# Altium project Lattice_FPGA_development_board.PrjPcb (part 1 of 2)
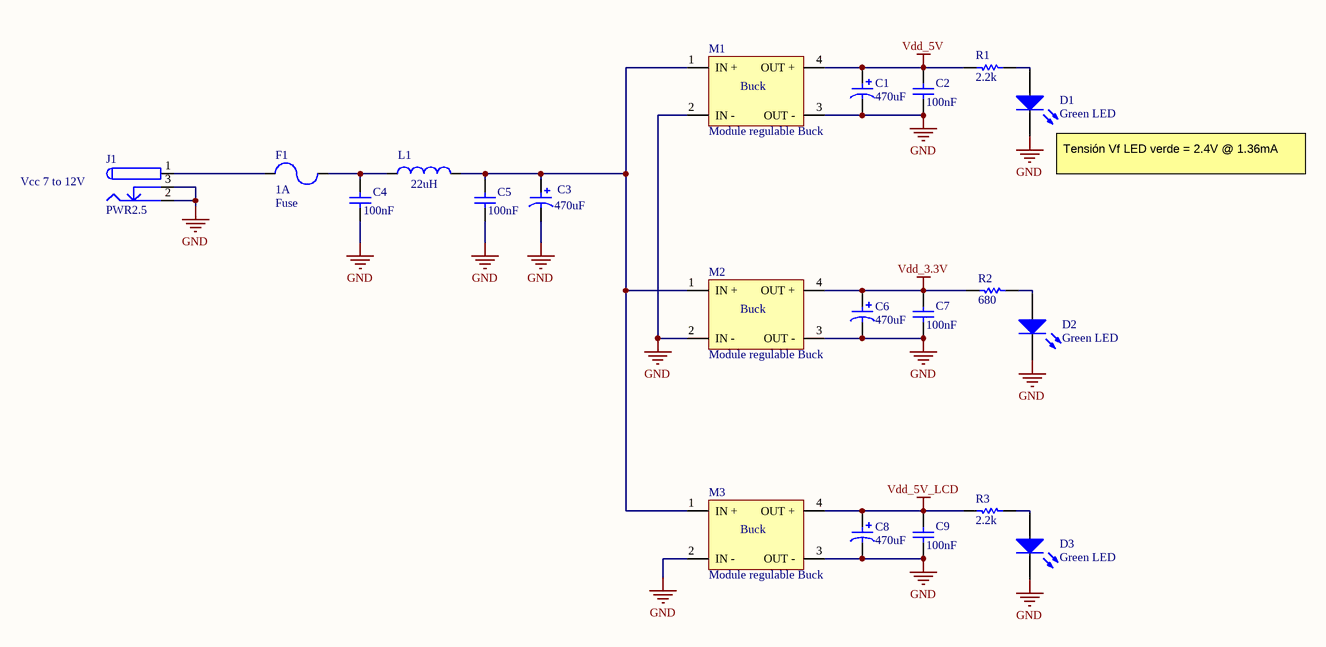
[diagram p0: power_supply.SchDoc]
18 sheets, 381 parts. Net scope: global (net labels, ports and power ports of the same name join across sheets).
Board file: PCB.PcbDoc
Sheets:
  power_supply.SchDoc
  FPGA_J3_J4.SchDoc
  FPGA_J6_J8.SchDoc
  FPGA_breadboard_connections.SchDoc
  IBM_PC_CPU.SchDoc
  IBM_PC_RAM.SchDoc
  IBM_PC_ROM_BIOS.SchDoc
  pc_data_bus_leds.SchDoc
  pc_data_bus_input_switches.SchDoc
  pc_address_bus_leds.SchDoc
  seven_segment_displays.SchDoc
  buzzer.SchDoc
  USB_TTL_converter.SchDoc
  micro_sd.SchDoc
  NOR_flash.SchDoc
  stm32h750.SchDoc
  LCD_RGB_parallel_connector.SchDoc
  stm32f411.SchDoc

## Sheet power_supply.SchDoc
size A3; SheetNumber: 1; SheetTotal: 19; SPICEModelCacheCEUNFSJS: <root> / <DocumentId>CEUNFSJS</DocumentId> / </root>

### Parts
C1  value 470uF  [electrolytic 470uF/25V]  (hidden comment: Electrolytic capacitor)
C2  value 100nF  [capacitor 0805]  (hidden comment: ceramic capacitor)
C3  value 470uF  [electrolytic 470uF/25V]  (hidden comment: Electrolytic capacitor)
C4  value 100nF  [capacitor 0805]  (hidden comment: ceramic capacitor)
C5  value 100nF  [capacitor 0805]  (hidden comment: ceramic capacitor)
C6  value 470uF  [electrolytic 470uF/25V]  (hidden comment: Electrolytic capacitor)
C7  value 100nF  [capacitor 0805]  (hidden comment: ceramic capacitor)
C8  value 470uF  [electrolytic 470uF/25V]  (hidden comment: Electrolytic capacitor)
C9  value 100nF  [capacitor 0805]  (hidden comment: ceramic capacitor)
D1  Green LED  [led 0603 clear]
D2  Green LED  [led 0603 clear]
D3  Green LED  [led 0603 clear]
F1  Fuse  value 1A  [Fuse]
J1  PWR2.5  [female connector DC-005]
L1  value 22uH  [ferrite inductor 22uH]  (hidden comment: Inductor)
M1  Module regulable Buck  [module step down MP1584]
M2  Module regulable Buck  [module step down MP1584]
M3  Module regulable Buck  [module step down MP1584]
R1  value 2.2k  [resistor 0603]  (hidden comment: resistor)
R2  value 680  [resistor 0603]  (hidden comment: resistor)
R3  value 2.2k  [resistor 0603]  (hidden comment: resistor)

### Nets
GND: C1.2 C2.2 C3.2 C4.2 C5.2 C6.2 C7.2 C8.2 C9.2 D1.2(K) D2.2(K) D3.2(K) J1.2 J1.3 M1.2(IN_-) M1.3(OUT_-) M2.2(IN_-) M2.3(OUT_-) M3.2(IN_-) M3.3(OUT_-)
Vdd_3.3V: C6.1 C7.1 M2.4(OUT_+) R2.2
Vdd_5V: C1.1 C2.1 M1.4(OUT_+) R1.2
Vdd_5V_LCD: C8.1 C9.1 M3.4(OUT_+) R3.2
NetC3_1: C3.1 C5.1 L1.2 M1.1(IN_+) M2.1(IN_+) M3.1(IN_+)
NetC4_1: C4.1 F1.2 L1.1
NetD1_1: D1.1(A) R1.1
NetD2_1: D2.1(A) R2.1
NetD3_1: D3.1(A) R3.1
NetF1_1: F1.1 J1.1

### Notes on the sheet
- Vcc 7 to 12V
- (near D1) Tensión Vf LED verde = 2.4V @ 1.36mA
- (in symbol Module regulable Step Down converter) Buck

### Library data of the parts
C2 C4 C5 C7 C9 = ceramic capacitor: Multilayer ceramic capacitor; V: 50; LCSC part: C1711; Package: 0805
D1-D3 = LED2: Green LED 0603; Package: 0603
J1 = PWR2.5: Low Voltage Power Supply Connector; Publisher: Altium Limited
M1-M3 = Module regulable Step Down converter: pin to pad: 1>2 2>1 3>4 4>3
R1-R3 = resistor: Package: 0603

## Sheet FPGA_J3_J4.SchDoc
size A3; SheetNumber: 2; SheetTotal: 18
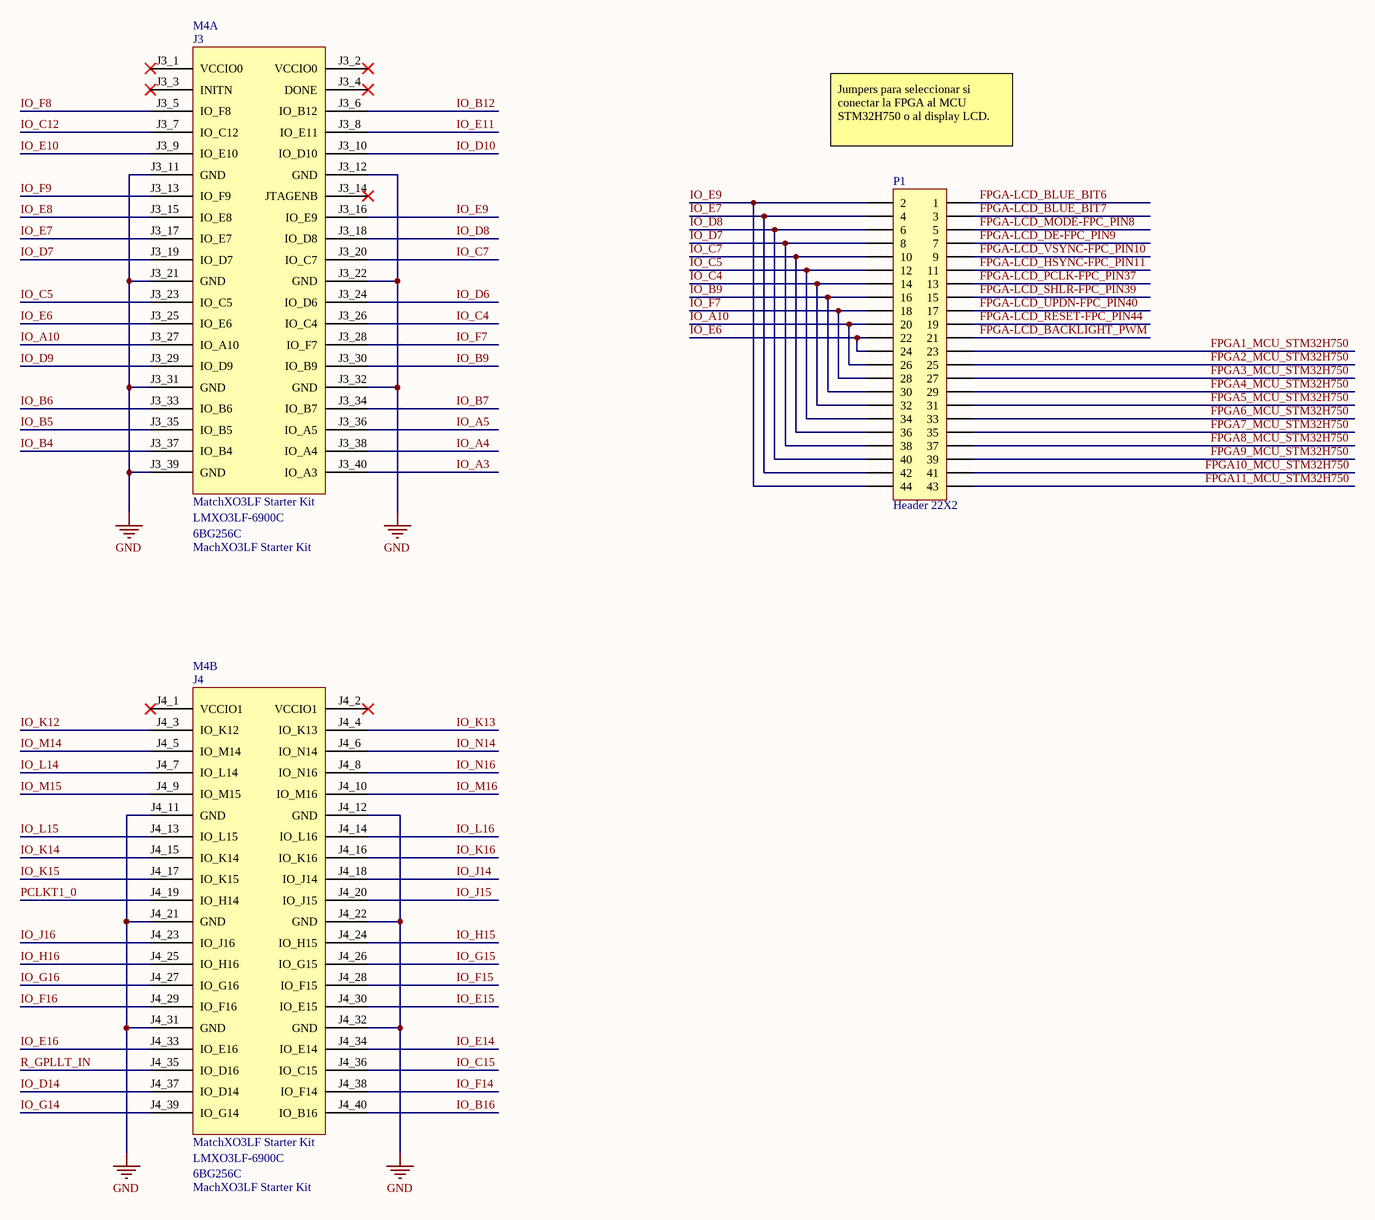
[diagram p1: FPGA_J3_J4.SchDoc]

### Parts
M4  MachXO3LF Starter Kit  [Lattice MachXO3LF starter kit]  (parts A,B of 4)
P1  Header 22X2  [HDR2X22]

### Nets
GND: M4.J3_11(GND) M4.J3_12(GND) M4.J3_21(GND) M4.J3_22(GND) M4.J3_31(GND) M4.J3_32(GND) M4.J3_39(GND) M4.J4_11(GND) M4.J4_12(GND) M4.J4_21(GND) M4.J4_22(GND) M4.J4_31(GND) M4.J4_32(GND)
FPGA1_MCU_STM32H750: P1.23
FPGA2_MCU_STM32H750: P1.25
FPGA3_MCU_STM32H750: P1.27
FPGA4_MCU_STM32H750: P1.29
FPGA5_MCU_STM32H750: P1.31
FPGA6_MCU_STM32H750: P1.33
FPGA7_MCU_STM32H750: P1.35
FPGA8_MCU_STM32H750: P1.37
FPGA9_MCU_STM32H750: P1.39
FPGA10_MCU_STM32H750: P1.41
FPGA11_MCU_STM32H750: P1.43
FPGA-LCD_BACKLIGHT_PWM: P1.21
FPGA-LCD_BLUE_BIT6: P1.1
FPGA-LCD_BLUE_BIT7: P1.3
FPGA-LCD_DE-FPC_PIN9: P1.7
FPGA-LCD_HSYNC-FPC_PIN11: P1.11
FPGA-LCD_MODE-FPC_PIN8: P1.5
FPGA-LCD_PCLK-FPC_PIN37: P1.13
FPGA-LCD_RESET-FPC_PIN44: P1.19
FPGA-LCD_SHLR-FPC_PIN39: P1.15
FPGA-LCD_UPDN-FPC_PIN40: P1.17
FPGA-LCD_VSYNC-FPC_PIN10: P1.9
IO_A3: M4.J3_40(IO_A3)
IO_A4: M4.J3_38(IO_A4)
IO_A5: M4.J3_36(IO_A5)
IO_A10: M4.J3_27(IO_A10) P1.20 P1.26
IO_B4: M4.J3_37(IO_B4)
IO_B5: M4.J3_35(IO_B5)
IO_B6: M4.J3_33(IO_B6)
IO_B7: M4.J3_34(IO_B7)
IO_B9: M4.J3_30(IO_B9) P1.16 P1.30
IO_B12: M4.J3_6(IO_B12)
IO_B16: M4.J4_40(IO_B16)
IO_C4: M4.J3_26(IO_C4) P1.14 P1.32
IO_C5: M4.J3_23(IO_C5) P1.12 P1.34
IO_C7: M4.J3_20(IO_C7) P1.10 P1.36
IO_C12: M4.J3_7(IO_C12)
IO_C15: M4.J4_36(IO_C15)
IO_D6: M4.J3_24(IO_D6)
IO_D7: M4.J3_19(IO_D7) P1.8 P1.38
IO_D8: M4.J3_18(IO_D8) P1.6 P1.40
IO_D9: M4.J3_29(IO_D9)
IO_D10: M4.J3_10(IO_D10)
IO_D14: M4.J4_37(IO_D14)
IO_E6: M4.J3_25(IO_E6) P1.22 P1.24
IO_E7: M4.J3_17(IO_E7) P1.4 P1.42
IO_E8: M4.J3_15(IO_E8)
IO_E9: M4.J3_16(IO_E9) P1.2 P1.44
IO_E10: M4.J3_9(IO_E10)
IO_E11: M4.J3_8(IO_E11)
IO_E14: M4.J4_34(IO_E14)
IO_E15: M4.J4_30(IO_E15)
IO_E16: M4.J4_33(IO_E16)
IO_F7: M4.J3_28(IO_F7) P1.18 P1.28
IO_F8: M4.J3_5(IO_F8)
IO_F9: M4.J3_13(IO_F9)
IO_F14: M4.J4_38(IO_F14)
IO_F15: M4.J4_28(IO_F15)
IO_F16: M4.J4_29(IO_F16)
IO_G14: M4.J4_39(IO_G14)
IO_G15: M4.J4_26(IO_G15)
IO_G16: M4.J4_27(IO_G16)
IO_H15: M4.J4_24(IO_H15)
IO_H16: M4.J4_25(IO_H16)
IO_J14: M4.J4_18(IO_J14)
IO_J15: M4.J4_20(IO_J15)
IO_J16: M4.J4_23(IO_J16)
IO_K12: M4.J4_3(IO_K12)
IO_K13: M4.J4_4(IO_K13)
IO_K14: M4.J4_15(IO_K14)
IO_K15: M4.J4_17(IO_K15)
IO_K16: M4.J4_16(IO_K16)
IO_L14: M4.J4_7(IO_L14)
IO_L15: M4.J4_13(IO_L15)
IO_L16: M4.J4_14(IO_L16)
IO_M14: M4.J4_5(IO_M14)
IO_M15: M4.J4_9(IO_M15)
IO_M16: M4.J4_10(IO_M16)
IO_N14: M4.J4_6(IO_N14)
IO_N16: M4.J4_8(IO_N16)
PCLKT1_0: M4.J4_19(IO_H14)
R_GPLLT_IN: M4.J4_35(IO_D16)

Not connected (* = marked no-connect by the designer): M4 J3_1(VCCIO0)* J3_2(VCCIO0)* J3_3(INITN)* J3_4(DONE)* J3_14(JTAGENB)* J4_1(VCCIO1)* J4_2(VCCIO1)*

### Notes on the sheet
- Jumpers para seleccionar si conectar la FPGA al MCU STM32H750 o al display LCD.
- (in symbol Lattice_MachXO3LF_starter_kit, part A) J3; MatchXO3LF Starter Kit; LMXO3LF-6900C; 6BG256C
- (in symbol Lattice_MachXO3LF_starter_kit, part B) J4; MatchXO3LF Starter Kit; LMXO3LF-6900C; 6BG256C

### Library data of the parts
M4 = Lattice_MachXO3LF_starter_kit: FPGA development board - MachXO3LF Starter Kit
P1 = Header 22X2: Header, 22-Pin, Dual row; LatestRevisionDate: 17-Jul-2002; LatestRevisionNote: Re-released for DXP Platform.; Publisher: Altium Limited

## Sheet FPGA_J6_J8.SchDoc
size A3; SheetNumber: 3; SheetTotal: 18
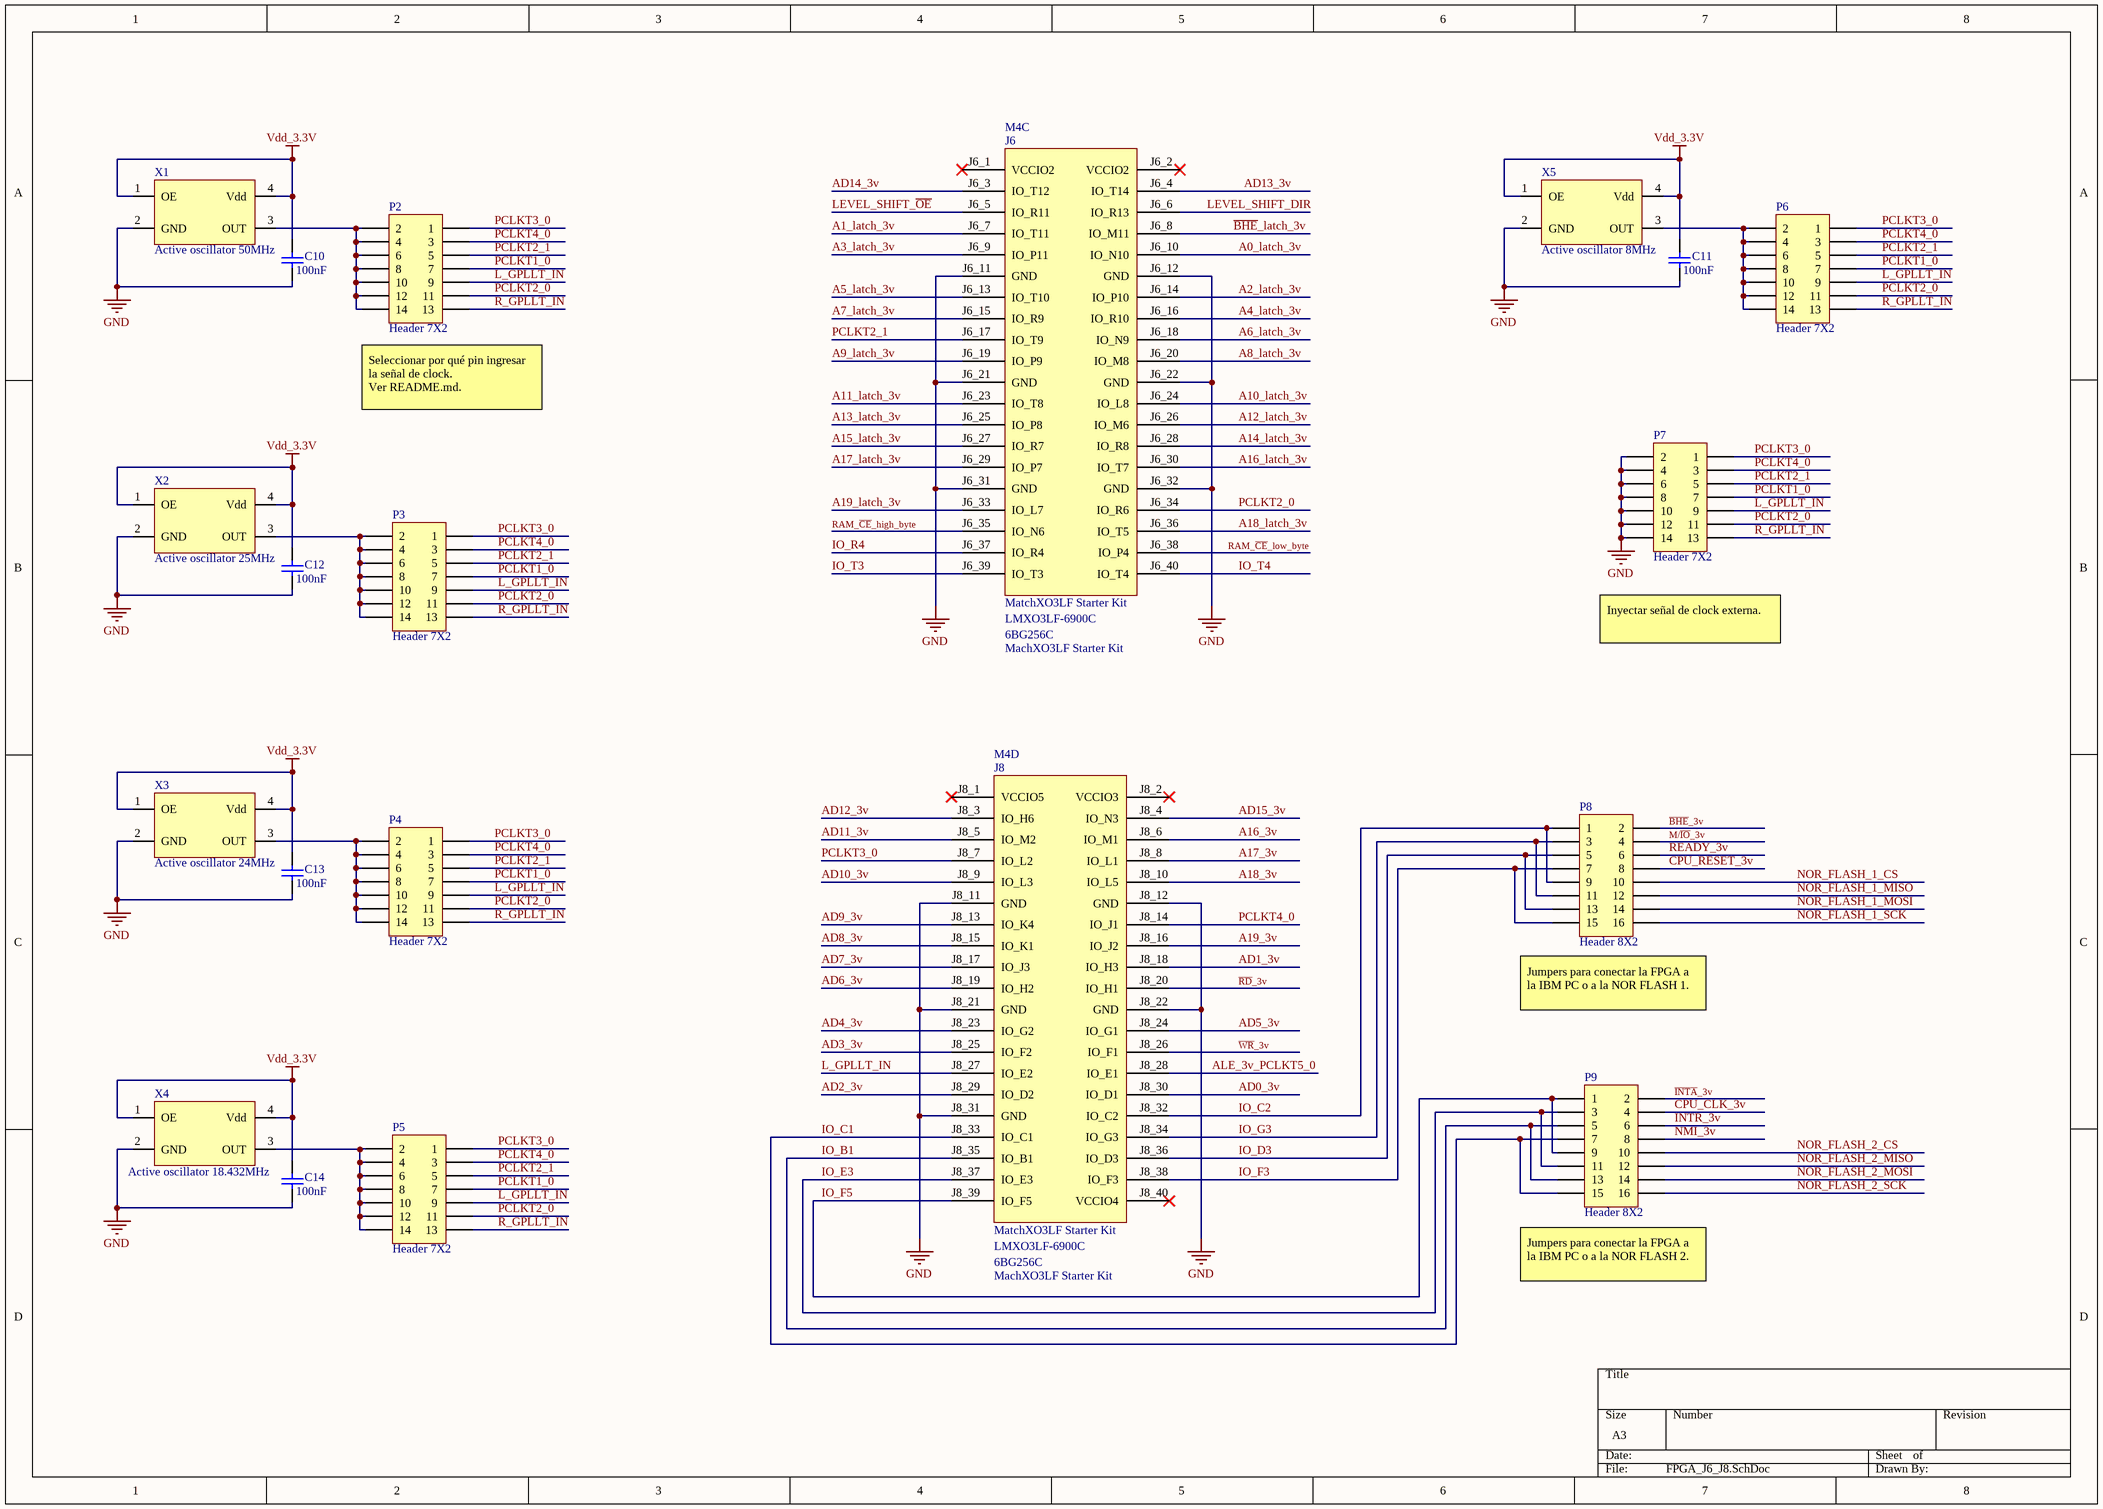
[diagram p2: FPGA_J6_J8.SchDoc]

### Parts
C10  value 100nF  [capacitor 0603]  (hidden comment: Ceramic capacitor)
C11  value 100nF  [capacitor 0603]  (hidden comment: Ceramic capacitor)
C12  value 100nF  [capacitor 0603]  (hidden comment: Ceramic capacitor)
C13  value 100nF  [capacitor 0603]  (hidden comment: Ceramic capacitor)
C14  value 100nF  [capacitor 0603]  (hidden comment: Ceramic capacitor)
M4  MachXO3LF Starter Kit  [Lattice MachXO3LF starter kit]  (parts C,D of 4)
P2  Header 7X2  [HDR2X7]
P3  Header 7X2  [HDR2X7]
P4  Header 7X2  [HDR2X7]
P5  Header 7X2  [HDR2X7]
P6  Header 7X2  [HDR2X7]
P7  Header 7X2  [HDR2X7]
P8  Header 8X2  [HDR2X8]
P9  Header 8X2  [HDR2X8]
X1  Active oscillator 50MHz  [Active oscillator 3.2mm x 2.5mm]
X2  Active oscillator 25MHz  [Active oscillator 3.2mm x 2.5mm]
X3  Active oscillator 24MHz  [Active oscillator 3.2mm x 2.5mm]
X4  Active oscillator 18.432MHz  [Active oscillator 3.2mm x 2.5mm]
X5  Active oscillator 8MHz  [Active oscillator 3.2mm x 2.5mm]

### Nets
GND: C10.1 C11.1 C12.1 C13.1 C14.1 M4.J6_11(GND) M4.J6_12(GND) M4.J6_21(GND) M4.J6_22(GND) M4.J6_31(GND) M4.J6_32(GND) M4.J8_11(GND) M4.J8_12(GND) M4.J8_21(GND) M4.J8_22(GND) M4.J8_31(GND) P7.2 P7.4 P7.6 P7.8 P7.10 P7.12 P7.14 X1.2(GND) X2.2(GND) X3.2(GND) X4.2(GND) X5.2(GND)
Vdd_3.3V: C10.2 C11.2 C12.2 C13.2 C14.2 X1.1(OE) X1.4(Vdd) X2.1(OE) X2.4(Vdd) X3.1(OE) X3.4(Vdd) X4.1(OE) X4.4(Vdd) X5.1(OE) X5.4(Vdd)
A0_latch_3v: M4.J6_10(IO_N10)
A1_latch_3v: M4.J6_7(IO_T11)
A2_latch_3v: M4.J6_14(IO_P10)
A3_latch_3v: M4.J6_9(IO_P11)
A4_latch_3v: M4.J6_16(IO_R10)
A5_latch_3v: M4.J6_13(IO_T10)
A6_latch_3v: M4.J6_18(IO_N9)
A7_latch_3v: M4.J6_15(IO_R9)
A8_latch_3v: M4.J6_20(IO_M8)
A9_latch_3v: M4.J6_19(IO_P9)
A10_latch_3v: M4.J6_24(IO_L8)
A11_latch_3v: M4.J6_23(IO_T8)
A12_latch_3v: M4.J6_26(IO_M6)
A13_latch_3v: M4.J6_25(IO_P8)
A14_latch_3v: M4.J6_28(IO_R8)
A15_latch_3v: M4.J6_27(IO_R7)
A16_3v: M4.J8_6(IO_M1)
A16_latch_3v: M4.J6_30(IO_T7)
A17_3v: M4.J8_8(IO_L1)
A17_latch_3v: M4.J6_29(IO_P7)
A18_3v: M4.J8_10(IO_L5)
A18_latch_3v: M4.J6_36(IO_T5)
A19_3v: M4.J8_16(IO_J2)
A19_latch_3v: M4.J6_33(IO_L7)
AD0_3v: M4.J8_30(IO_D1)
AD1_3v: M4.J8_18(IO_H3)
AD2_3v: M4.J8_29(IO_D2)
AD3_3v: M4.J8_25(IO_F2)
AD4_3v: M4.J8_23(IO_G2)
AD5_3v: M4.J8_24(IO_G1)
AD6_3v: M4.J8_19(IO_H2)
AD7_3v: M4.J8_17(IO_J3)
AD8_3v: M4.J8_15(IO_K1)
AD9_3v: M4.J8_13(IO_K4)
AD10_3v: M4.J8_9(IO_L3)
AD11_3v: M4.J8_5(IO_M2)
AD12_3v: M4.J8_3(IO_H6)
AD13_3v: M4.J6_4(IO_T14)
AD14_3v: M4.J6_3(IO_T12)
AD15_3v: M4.J8_4(IO_N3)
ALE_3v_PCLKT5_0: M4.J8_28(IO_E1)
~{BHE}_3v: P8.2
~{BHE}_latch_3v: M4.J6_8(IO_M11)
CPU_CLK_3v: P9.4
CPU_RESET_3v: P8.8
~{INTA}_3v: P9.2
INTR_3v: P9.6
IO_B1: M4.J8_35(IO_B1) P9.5 P9.13
IO_C1: M4.J8_33(IO_C1) P9.7 P9.15
IO_C2: M4.J8_32(IO_C2) P8.1 P8.9
IO_D3: M4.J8_36(IO_D3) P8.5 P8.13
IO_E3: M4.J8_37(IO_E3) P9.3 P9.11
IO_F3: M4.J8_38(IO_F3) P8.7 P8.15
IO_F5: M4.J8_39(IO_F5) P9.1 P9.9
IO_G3: M4.J8_34(IO_G3) P8.3 P8.11
IO_R4: M4.J6_37(IO_R4)
IO_T3: M4.J6_39(IO_T3)
IO_T4: M4.J6_40(IO_T4)
L_GPLLT_IN: M4.J8_27(IO_E2) P2.9 P3.9 P4.9 P5.9 P6.9 P7.9
LEVEL_SHIFT_DIR: M4.J6_6(IO_R13)
LEVEL_SHIFT_~{OE}: M4.J6_5(IO_R11)
M/~{IO}_3v: P8.4
NMI_3v: P9.8
NOR_FLASH_1_CS: P8.10
NOR_FLASH_1_MISO: P8.12
NOR_FLASH_1_MOSI: P8.14
NOR_FLASH_1_SCK: P8.16
NOR_FLASH_2_CS: P9.10
NOR_FLASH_2_MISO: P9.12
NOR_FLASH_2_MOSI: P9.14
NOR_FLASH_2_SCK: P9.16
PCLKT1_0: P2.7 P3.7 P4.7 P5.7 P6.7 P7.7
PCLKT2_0: M4.J6_34(IO_R6) P2.11 P3.11 P4.11 P5.11 P6.11 P7.11
PCLKT2_1: M4.J6_17(IO_T9) P2.5 P3.5 P4.5 P5.5 P6.5 P7.5
PCLKT3_0: M4.J8_7(IO_L2) P2.1 P3.1 P4.1 P5.1 P6.1 P7.1
PCLKT4_0: M4.J8_14(IO_J1) P2.3 P3.3 P4.3 P5.3 P6.3 P7.3
~{RD}_3v: M4.J8_20(IO_H1)
R_GPLLT_IN: P2.13 P3.13 P4.13 P5.13 P6.13 P7.13
RAM_~{CE}_high_byte: M4.J6_35(IO_N6)
RAM_~{CE}_low_byte: M4.J6_38(IO_P4)
READY_3v: P8.6
~{WR}_3v: M4.J8_26(IO_F1)
NetP2_2: P2.2 P2.4 P2.6 P2.8 P2.10 P2.12 P2.14 X1.3(OUT)
NetP3_2: P3.2 P3.4 P3.6 P3.8 P3.10 P3.12 P3.14 X2.3(OUT)
NetP4_2: P4.2 P4.4 P4.6 P4.8 P4.10 P4.12 P4.14 X3.3(OUT)
NetP5_2: P5.2 P5.4 P5.6 P5.8 P5.10 P5.12 P5.14 X4.3(OUT)
NetP6_2: P6.2 P6.4 P6.6 P6.8 P6.10 P6.12 P6.14 X5.3(OUT)

Not connected (* = marked no-connect by the designer): M4 J6_1(VCCIO2)* J6_2(VCCIO2)* J8_1(VCCIO5)* J8_2(VCCIO3)* J8_40(VCCIO4)*

### Notes on the sheet
- (near P2) Seleccionar por qué pin ingresar la señal de clock.
  Ver README.md.
- Inyectar señal de clock externa.
- (near P8) Jumpers para conectar la FPGA a la IBM PC o a la NOR FLASH 1.
- (near P9) Jumpers para conectar la FPGA a la IBM PC o a la NOR FLASH 2.
- (in symbol Lattice_MachXO3LF_starter_kit, part C) J6; MatchXO3LF Starter Kit; LMXO3LF-6900C; 6BG256C
- (in symbol Lattice_MachXO3LF_starter_kit, part D) J8; MatchXO3LF Starter Kit; LMXO3LF-6900C; 6BG256C

### Library data of the parts
C10-C14 = Ceramic capacitor: Multilayer ceramic capacitor; V: 50; LCSC part: C14663; Package: 0603
M4 = Lattice_MachXO3LF_starter_kit: as M4 on sheet FPGA_J3_J4
P2-P7 = Header 7X2: Header, 7-Pin, Dual row; LatestRevisionDate: 17-Jul-2002; LatestRevisionNote: Re-released for DXP Platform.; Publisher: Altium Limited
P8 P9 = Header 8X2: Header, 8-Pin, Dual row; LatestRevisionDate: 17-Jul-2002; LatestRevisionNote: Re-released for DXP Platform.; Publisher: Altium Limited
X1-X5 = Active oscillator

## Sheet FPGA_breadboard_connections.SchDoc
size A3; SheetNumber: 4; SheetTotal: 18
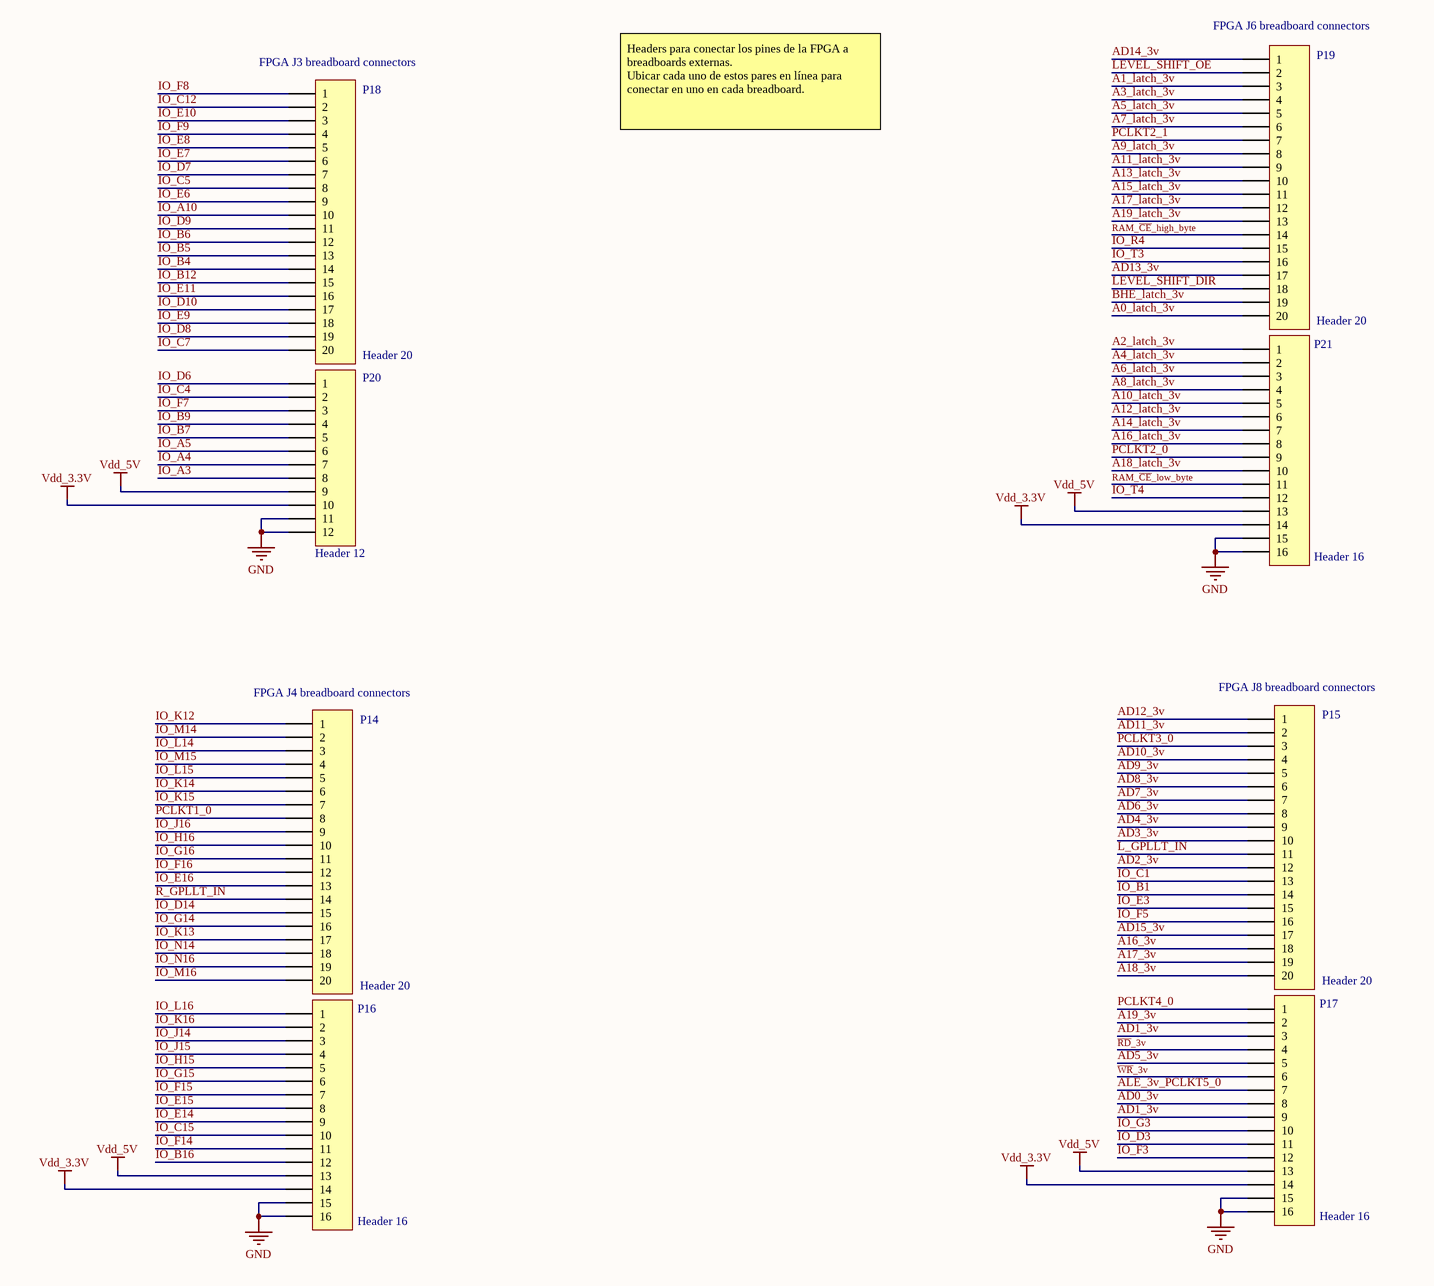
[diagram p3: FPGA_breadboard_connections.SchDoc]

### Parts
P14  Header 20  [HDR1X20]
P15  Header 20  [HDR1X20]
P16  Header 16  [HDR1X16]
P17  Header 16  [HDR1X16]
P18  Header 20  [HDR1X20]
P19  Header 20  [HDR1X20]
P20  Header 12  [HDR1X12]
P21  Header 16  [HDR1X16]

### Nets
GND: P16.15 P16.16 P17.15 P17.16 P20.11 P20.12 P21.15 P21.16
Vdd_3.3V: P16.14 P17.14 P20.10 P21.14
Vdd_5V: P16.13 P17.13 P20.9 P21.13
A0_latch_3v: P19.20
A1_latch_3v: P19.3
A2_latch_3v: P21.1
A3_latch_3v: P19.4
A4_latch_3v: P21.2
A5_latch_3v: P19.5
A6_latch_3v: P21.3
A7_latch_3v: P19.6
A8_latch_3v: P21.4
A9_latch_3v: P19.8
A10_latch_3v: P21.5
A11_latch_3v: P19.9
A12_latch_3v: P21.6
A13_latch_3v: P19.10
A14_latch_3v: P21.7
A15_latch_3v: P19.11
A16_3v: P15.18
A16_latch_3v: P21.8
A17_3v: P15.19
A17_latch_3v: P19.12
A18_3v: P15.20
A18_latch_3v: P21.10
A19_3v: P17.2
A19_latch_3v: P19.13
AD0_3v: P17.8
AD1_3v: P17.3 P17.9
AD2_3v: P15.12
AD3_3v: P15.10
AD4_3v: P15.9
AD5_3v: P17.5
AD6_3v: P15.8
AD7_3v: P15.7
AD8_3v: P15.6
AD9_3v: P15.5
AD10_3v: P15.4
AD11_3v: P15.2
AD12_3v: P15.1
AD13_3v: P19.17
AD14_3v: P19.1
AD15_3v: P15.17
ALE_3v_PCLKT5_0: P17.7
~{BHE}_latch_3v: P19.19
IO_A3: P20.8
IO_A4: P20.7
IO_A5: P20.6
IO_A10: P18.10
IO_B1: P15.14
IO_B4: P18.14
IO_B5: P18.13
IO_B6: P18.12
IO_B7: P20.5
IO_B9: P20.4
IO_B12: P18.15
IO_B16: P16.12
IO_C1: P15.13
IO_C4: P20.2
IO_C5: P18.8
IO_C7: P18.20
IO_C12: P18.2
IO_C15: P16.10
IO_D3: P17.11
IO_D6: P20.1
IO_D7: P18.7
IO_D8: P18.19
IO_D9: P18.11
IO_D10: P18.17
IO_D14: P14.15
IO_E3: P15.15
IO_E6: P18.9
IO_E7: P18.6
IO_E8: P18.5
IO_E9: P18.18
IO_E10: P18.3
IO_E11: P18.16
IO_E14: P16.9
IO_E15: P16.8
IO_E16: P14.13
IO_F3: P17.12
IO_F5: P15.16
IO_F7: P20.3
IO_F8: P18.1
IO_F9: P18.4
IO_F14: P16.11
IO_F15: P16.7
IO_F16: P14.12
IO_G3: P17.10
IO_G14: P14.16
IO_G15: P16.6
IO_G16: P14.11
IO_H15: P16.5
IO_H16: P14.10
IO_J14: P16.3
IO_J15: P16.4
IO_J16: P14.9
IO_K12: P14.1
IO_K13: P14.17
IO_K14: P14.6
IO_K15: P14.7
IO_K16: P16.2
IO_L14: P14.3
IO_L15: P14.5
IO_L16: P16.1
IO_M14: P14.2
IO_M15: P14.4
IO_M16: P14.20
IO_N14: P14.18
IO_N16: P14.19
IO_R4: P19.15
IO_T3: P19.16
IO_T4: P21.12
L_GPLLT_IN: P15.11
LEVEL_SHIFT_DIR: P19.18
LEVEL_SHIFT_~{OE}: P19.2
PCLKT1_0: P14.8
PCLKT2_0: P21.9
PCLKT2_1: P19.7
PCLKT3_0: P15.3
PCLKT4_0: P17.1
~{RD}_3v: P17.4
R_GPLLT_IN: P14.14
RAM_~{CE}_high_byte: P19.14
RAM_~{CE}_low_byte: P21.11
~{WR}_3v: P17.6

### Notes on the sheet
- (near P19) FPGA J6 breadboard connectors
- (near P18) FPGA J3 breadboard connectors
- Headers para conectar los pines de la FPGA a breadboards externas.
  Ubicar cada uno de estos pares en línea para conectar en uno en cada breadboard.
- (near P14) FPGA J4 breadboard connectors
- (near P15) FPGA J8 breadboard connectors

### Library data of the parts
P14 P15 P18 P19 = Header 20: Header, 20-Pin; LatestRevisionDate: 17-Jul-2002; LatestRevisionNote: Re-released for DXP Platform.; Publisher: Altium Limited
P16 P17 P21 = Header 16: Header, 16-Pin; LatestRevisionDate: 17-Jul-2002; LatestRevisionNote: Re-released for DXP Platform.; Publisher: Altium Limited
P20 = Header 12: Header, 12-Pin; LatestRevisionDate: 17-Jul-2002; LatestRevisionNote: Re-released for DXP Platform.; Publisher: Altium Limited

## Sheet IBM_PC_CPU.SchDoc
size A3; SheetNumber: 6; SheetTotal: 18
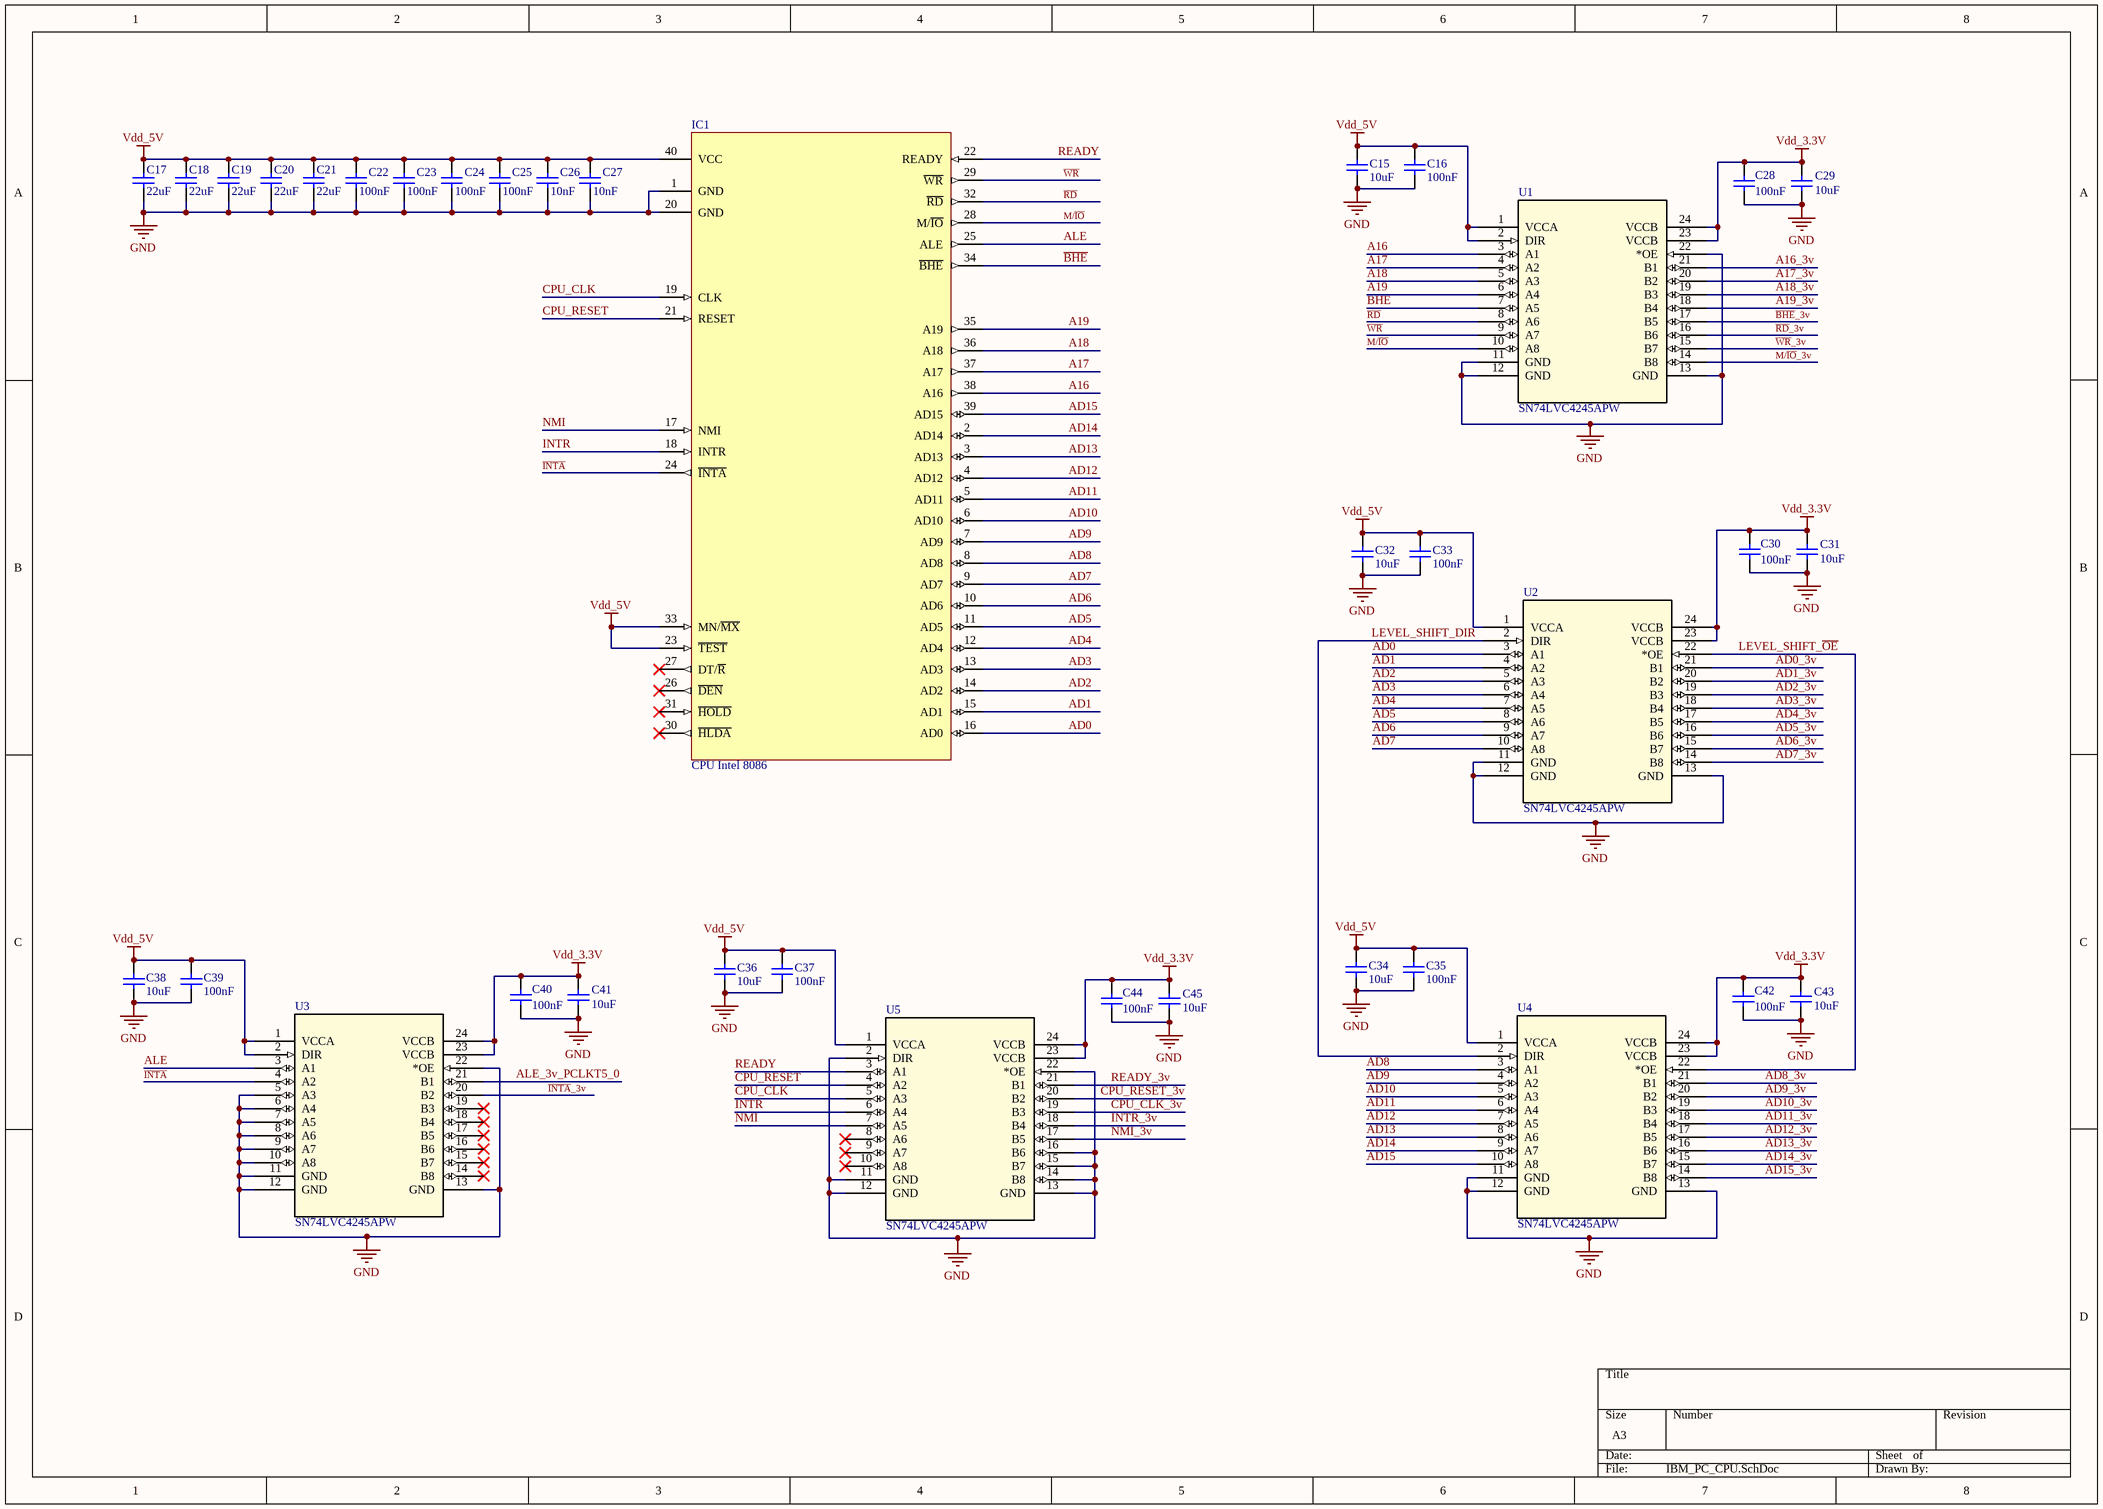
[diagram p4: IBM_PC_CPU.SchDoc]

### Parts
C15  value 10uF  [capacitor 0603]  (hidden comment: ceramic capacitor)
C16  value 100nF  [capacitor 0603]  (hidden comment: Ceramic capacitor)
C17  value 22uF  [capacitor 0805]  (hidden comment: ceramic capacitor)
C18  value 22uF  [capacitor 0805]  (hidden comment: ceramic capacitor)
C19  value 22uF  [capacitor 0805]  (hidden comment: ceramic capacitor)
C20  value 22uF  [capacitor 0805]  (hidden comment: ceramic capacitor)
C21  value 22uF  [capacitor 0805]  (hidden comment: ceramic capacitor)
C22  value 100nF  [capacitor 0805]  (hidden comment: ceramic capacitor)
C23  value 100nF  [capacitor 0805]  (hidden comment: ceramic capacitor)
C24  value 100nF  [capacitor 0805]  (hidden comment: ceramic capacitor)
C25  value 100nF  [capacitor 0805]  (hidden comment: ceramic capacitor)
C26  value 10nF  [capacitor 0805]  (hidden comment: ceramic capacitor)
C27  value 10nF  [capacitor 0805]  (hidden comment: ceramic capacitor)
C28  value 100nF  [capacitor 0603]  (hidden comment: Ceramic capacitor)
C29  value 10uF  [capacitor 0603]  (hidden comment: ceramic capacitor)
C30  value 100nF  [capacitor 0603]  (hidden comment: Ceramic capacitor)
C31  value 10uF  [capacitor 0603]  (hidden comment: ceramic capacitor)
C32  value 10uF  [capacitor 0603]  (hidden comment: ceramic capacitor)
C33  value 100nF  [capacitor 0603]  (hidden comment: Ceramic capacitor)
C34  value 10uF  [capacitor 0603]  (hidden comment: ceramic capacitor)
C35  value 100nF  [capacitor 0603]  (hidden comment: Ceramic capacitor)
C36  value 10uF  [capacitor 0603]  (hidden comment: ceramic capacitor)
C37  value 100nF  [capacitor 0603]  (hidden comment: Ceramic capacitor)
C38  value 10uF  [capacitor 0603]  (hidden comment: ceramic capacitor)
C39  value 100nF  [capacitor 0603]  (hidden comment: Ceramic capacitor)
C40  value 100nF  [capacitor 0603]  (hidden comment: Ceramic capacitor)
C41  value 10uF  [capacitor 0603]  (hidden comment: ceramic capacitor)
C42  value 100nF  [capacitor 0603]  (hidden comment: Ceramic capacitor)
C43  value 10uF  [capacitor 0603]  (hidden comment: ceramic capacitor)
C44  value 100nF  [capacitor 0603]  (hidden comment: Ceramic capacitor)
C45  value 10uF  [capacitor 0603]  (hidden comment: ceramic capacitor)
IC1  CPU Intel 8086  [PDIP-40PIN]
U1  SN74LVC4245APW  [PW24]
U2  SN74LVC4245APW  [PW24]
U3  SN74LVC4245APW  [PW24]
U4  SN74LVC4245APW  [PW24]
U5  SN74LVC4245APW  [PW24]

### Nets
GND: C15.1 C16.1 C17.1 C18.1 C19.1 C20.1 C21.1 C22.2 C23.2 C24.2 C25.2 C26.2 C27.2 C28.1 C29.1 C30.1 C31.1 C32.1 C33.1 C34.1 C35.1 C36.1 C37.1 C38.1 C39.1 C40.1 C41.1 C42.1 C43.1 C44.1 C45.1 IC1.1(GND) IC1.20(GND) U1.11(GND) U1.12(GND) U1.13(GND) U1.22(*OE) U2.11(GND) U2.12(GND) U2.13(GND) U3.5(A3) U3.6(A4) U3.7(A5) U3.8(A6) U3.9(A7) U3.10(A8) U3.11(GND) U3.12(GND) U3.13(GND) U3.22(*OE) U4.11(GND) U4.12(GND) U4.13(GND) U5.2(DIR) U5.11(GND) U5.12(GND) U5.13(GND) U5.14(B8) U5.15(B7) U5.16(B6) U5.22(*OE)
Vdd_3.3V: C28.2 C29.2 C30.2 C31.2 C40.2 C41.2 C42.2 C43.2 C44.2 C45.2 U1.23(VCCB) U1.24(VCCB) U2.23(VCCB) U2.24(VCCB) U3.23(VCCB) U3.24(VCCB) U4.23(VCCB) U4.24(VCCB) U5.23(VCCB) U5.24(VCCB)
Vdd_5V: C15.2 C16.2 C17.2 C18.2 C19.2 C20.2 C21.2 C22.1 C23.1 C24.1 C25.1 C26.1 C27.1 C32.2 C33.2 C34.2 C35.2 C36.2 C37.2 C38.2 C39.2 IC1.23(~{TEST}) IC1.33(MN/~{MX}) IC1.40(VCC) U1.1(VCCA) U1.2(DIR) U2.1(VCCA) U3.1(VCCA) U3.2(DIR) U4.1(VCCA) U5.1(VCCA)
A16: IC1.38(A16) U1.3(A1)
A16_3v: U1.21(B1)
A17: IC1.37(A17) U1.4(A2)
A17_3v: U1.20(B2)
A18: IC1.36(A18) U1.5(A3)
A18_3v: U1.19(B3)
A19: IC1.35(A19) U1.6(A4)
A19_3v: U1.18(B4)
AD0: IC1.16(AD0) U2.3(A1)
AD0_3v: U2.21(B1)
AD1: IC1.15(AD1) U2.4(A2)
AD1_3v: U2.20(B2)
AD2: IC1.14(AD2) U2.5(A3)
AD2_3v: U2.19(B3)
AD3: IC1.13(AD3) U2.6(A4)
AD3_3v: U2.18(B4)
AD4: IC1.12(AD4) U2.7(A5)
AD4_3v: U2.17(B5)
AD5: IC1.11(AD5) U2.8(A6)
AD5_3v: U2.16(B6)
AD6: IC1.10(AD6) U2.9(A7)
AD6_3v: U2.15(B7)
AD7: IC1.9(AD7) U2.10(A8)
AD7_3v: U2.14(B8)
AD8: IC1.8(AD8) U4.3(A1)
AD8_3v: U4.21(B1)
AD9: IC1.7(AD9) U4.4(A2)
AD9_3v: U4.20(B2)
AD10: IC1.6(AD10) U4.5(A3)
AD10_3v: U4.19(B3)
AD11: IC1.5(AD11) U4.6(A4)
AD11_3v: U4.18(B4)
AD12: IC1.4(AD12) U4.7(A5)
AD12_3v: U4.17(B5)
AD13: IC1.3(AD13) U4.8(A6)
AD13_3v: U4.16(B6)
AD14: IC1.2(AD14) U4.9(A7)
AD14_3v: U4.15(B7)
AD15: IC1.39(AD15) U4.10(A8)
AD15_3v: U4.14(B8)
ALE: IC1.25(ALE) U3.3(A1)
ALE_3v_PCLKT5_0: U3.21(B1)
~{BHE}: IC1.34(~{BHE}) U1.7(A5)
~{BHE}_3v: U1.17(B5)
CPU_CLK: IC1.19(CLK) U5.5(A3)
CPU_CLK_3v: U5.19(B3)
CPU_RESET: IC1.21(RESET) U5.4(A2)
CPU_RESET_3v: U5.20(B2)
~{INTA}: IC1.24(~{INTA}) U3.4(A2)
~{INTA}_3v: U3.20(B2)
INTR: IC1.18(INTR) U5.6(A4)
INTR_3v: U5.18(B4)
LEVEL_SHIFT_DIR: U2.2(DIR) U4.2(DIR)
LEVEL_SHIFT_~{OE}: U2.22(*OE) U4.22(*OE)
M/~{IO}: IC1.28(M/~{IO}) U1.10(A8)
M/~{IO}_3v: U1.14(B8)
NMI: IC1.17(NMI) U5.7(A5)
NMI_3v: U5.17(B5)
~{RD}: IC1.32(~{RD}) U1.8(A6)
~{RD}_3v: U1.16(B6)
READY: IC1.22(READY) U5.3(A1)
READY_3v: U5.21(B1)
~{WR}: IC1.29(~{WR}) U1.9(A7)
~{WR}_3v: U1.15(B7)

Not connected (* = marked no-connect by the designer): IC1 26(~{DEN})* 27(DT/~{R})* 30(~{HLDA})* 31(~{HOLD})*; U3 14(B8)* 15(B7)* 16(B6)* 17(B5)* 18(B4)* 19(B3)*; U5 8(A6)* 9(A7)* 10(A8)*

### Library data of the parts
C15 C29 C31 C32 C34 C36 C38 C41 C43 C45 = ceramic capacitor: Multilayer ceramic capacitor; V: 6.3; LCSC part: C1691; Package: 0603
C16 C28 C30 C33 C35 C37 C39 C40 C42 C44 = Ceramic capacitor: Multilayer ceramic capacitor; V: 50; LCSC part: C14663; Package: 0603
C17-C21 = ceramic capacitor: Multilayer ceramic capacitor; V: 25; LCSC part: C45783; Package: 0805
C22-C27 = ceramic capacitor: Multilayer ceramic capacitor; V: 50; Package: 0805
  C22-C25: LCSC part: C1711
  C26 C27: LCSC part: C1710
U1-U5 = SN74LVC4245APW: Octal Bus Transceiver And 3.3-V To 5-V Shifter With 3-State Outputs 24-TSSOP -40 to 85; Manufacturer_Name: Texas Instruments; Copyright: Copyright (C) 2025 Ultra Librarian. All rights reserved.; Manufacturer_Part_Number: SN74LVC4245APW; RefDes: RefDes; Type: Type

## Sheet IBM_PC_RAM.SchDoc
size A3; SheetNumber: 7; SheetTotal: 18
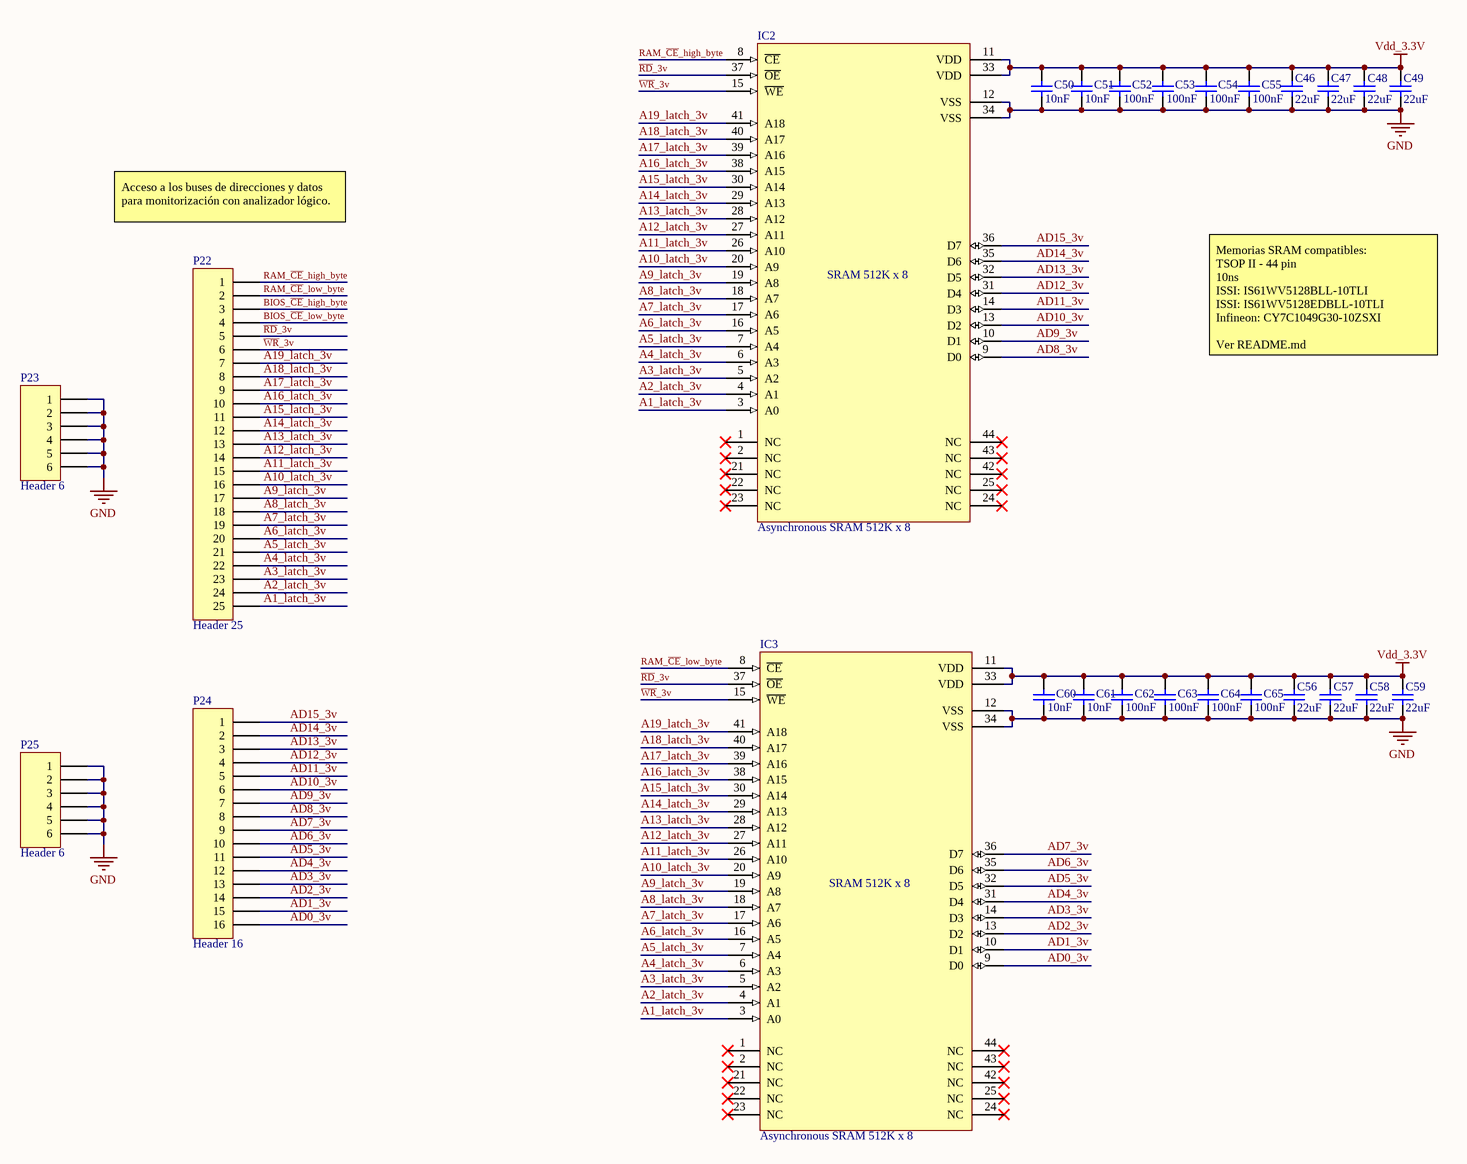
[diagram p5: IBM_PC_RAM.SchDoc]

### Parts
C46  value 22uF  [capacitor 0603]  (hidden comment: ceramic capacitor)
C47  value 22uF  [capacitor 0603]  (hidden comment: ceramic capacitor)
C48  value 22uF  [capacitor 0603]  (hidden comment: ceramic capacitor)
C49  value 22uF  [capacitor 0603]  (hidden comment: ceramic capacitor)
C50  value 10nF  [capacitor 0603]  (hidden comment: Ceramic capacitor)
C51  value 10nF  [capacitor 0603]  (hidden comment: Ceramic capacitor)
C52  value 100nF  [capacitor 0603]  (hidden comment: Ceramic capacitor)
C53  value 100nF  [capacitor 0603]  (hidden comment: Ceramic capacitor)
C54  value 100nF  [capacitor 0603]  (hidden comment: Ceramic capacitor)
C55  value 100nF  [capacitor 0603]  (hidden comment: Ceramic capacitor)
C56  value 22uF  [capacitor 0603]  (hidden comment: ceramic capacitor)
C57  value 22uF  [capacitor 0603]  (hidden comment: ceramic capacitor)
C58  value 22uF  [capacitor 0603]  (hidden comment: ceramic capacitor)
C59  value 22uF  [capacitor 0603]  (hidden comment: ceramic capacitor)
C60  value 10nF  [capacitor 0603]  (hidden comment: Ceramic capacitor)
C61  value 10nF  [capacitor 0603]  (hidden comment: Ceramic capacitor)
C62  value 100nF  [capacitor 0603]  (hidden comment: Ceramic capacitor)
C63  value 100nF  [capacitor 0603]  (hidden comment: Ceramic capacitor)
C64  value 100nF  [capacitor 0603]  (hidden comment: Ceramic capacitor)
C65  value 100nF  [capacitor 0603]  (hidden comment: Ceramic capacitor)
IC2  Asynchronous SRAM 512K x 8  [TSOP II - 44pin]
IC3  Asynchronous SRAM 512K x 8  [TSOP II - 44pin]
P22  Header 25  [HDR1X25]
P23  Header 6  [HDR1X6]
P24  Header 16  [HDR1X16]
P25  Header 6  [HDR1X6]

### Nets
GND: C46.1 C47.1 C48.1 C49.1 C50.1 C51.1 C52.1 C53.1 C54.1 C55.1 C56.1 C57.1 C58.1 C59.1 C60.1 C61.1 C62.1 C63.1 C64.1 C65.1 IC2.12(VSS) IC2.34(VSS) IC3.12(VSS) IC3.34(VSS) P23.1 P23.2 P23.3 P23.4 P23.5 P23.6 P25.1 P25.2 P25.3 P25.4 P25.5 P25.6
Vdd_3.3V: C46.2 C47.2 C48.2 C49.2 C50.2 C51.2 C52.2 C53.2 C54.2 C55.2 C56.2 C57.2 C58.2 C59.2 C60.2 C61.2 C62.2 C63.2 C64.2 C65.2 IC2.11(VDD) IC2.33(VDD) IC3.11(VDD) IC3.33(VDD)
A1_latch_3v: IC2.3(A0) IC3.3(A0) P22.25
A2_latch_3v: IC2.4(A1) IC3.4(A1) P22.24
A3_latch_3v: IC2.5(A2) IC3.5(A2) P22.23
A4_latch_3v: IC2.6(A3) IC3.6(A3) P22.22
A5_latch_3v: IC2.7(A4) IC3.7(A4) P22.21
A6_latch_3v: IC2.16(A5) IC3.16(A5) P22.20
A7_latch_3v: IC2.17(A6) IC3.17(A6) P22.19
A8_latch_3v: IC2.18(A7) IC3.18(A7) P22.18
A9_latch_3v: IC2.19(A8) IC3.19(A8) P22.17
A10_latch_3v: IC2.20(A9) IC3.20(A9) P22.16
A11_latch_3v: IC2.26(A10) IC3.26(A10) P22.15
A12_latch_3v: IC2.27(A11) IC3.27(A11) P22.14
A13_latch_3v: IC2.28(A12) IC3.28(A12) P22.13
A14_latch_3v: IC2.29(A13) IC3.29(A13) P22.12
A15_latch_3v: IC2.30(A14) IC3.30(A14) P22.11
A16_latch_3v: IC2.38(A15) IC3.38(A15) P22.10
A17_latch_3v: IC2.39(A16) IC3.39(A16) P22.9
A18_latch_3v: IC2.40(A17) IC3.40(A17) P22.8
A19_latch_3v: IC2.41(A18) IC3.41(A18) P22.7
AD0_3v: IC3.9(D0) P24.16
AD1_3v: IC3.10(D1) P24.15
AD2_3v: IC3.13(D2) P24.14
AD3_3v: IC3.14(D3) P24.13
AD4_3v: IC3.31(D4) P24.12
AD5_3v: IC3.32(D5) P24.11
AD6_3v: IC3.35(D6) P24.10
AD7_3v: IC3.36(D7) P24.9
AD8_3v: IC2.9(D0) P24.8
AD9_3v: IC2.10(D1) P24.7
AD10_3v: IC2.13(D2) P24.6
AD11_3v: IC2.14(D3) P24.5
AD12_3v: IC2.31(D4) P24.4
AD13_3v: IC2.32(D5) P24.3
AD14_3v: IC2.35(D6) P24.2
AD15_3v: IC2.36(D7) P24.1
BIOS_~{CE}_high_byte: P22.3
BIOS_~{CE}_low_byte: P22.4
~{RD}_3v: IC2.37(~{OE}) IC3.37(~{OE}) P22.5
RAM_~{CE}_high_byte: IC2.8(~{CE}) P22.1
RAM_~{CE}_low_byte: IC3.8(~{CE}) P22.2
~{WR}_3v: IC2.15(~{WE}) IC3.15(~{WE}) P22.6

Not connected (* = marked no-connect by the designer): IC2 1(NC)* 2(NC)* 21(NC)* 22(NC)* 23(NC)* 24(NC)* 25(NC)* 42(NC)* 43(NC)* 44(NC)*; IC3 1(NC)* 2(NC)* 21(NC)* 22(NC)* 23(NC)* 24(NC)* 25(NC)* 42(NC)* 43(NC)* 44(NC)*

### Notes on the sheet
- Acceso a los buses de direcciones y datos para monitorización con analizador lógico.
- Memorias SRAM compatibles:
  TSOP II - 44 pin
  10ns
  ISSI: IS61WV5128BLL-10TLI
  ISSI: IS61WV5128EDBLL-10TLI
  Infineon: CY7C1049G30-10ZSXI
  Ver README.md
- (in symbol Asynchronous SRAM 512K x 8) SRAM 512K x 8

### Library data of the parts
C46-C49 C56-C59 = ceramic capacitor: Multilayer ceramic capacitor; V: 6.3; LCSC part: C59461; Package: 0603
C50-C55 C60-C65 = Ceramic capacitor: Multilayer ceramic capacitor; V: 50; Package: 0603
  C50 C51 C60 C61: LCSC part: C1591
  C52-C55 C62-C65: LCSC part: C14663
IC2 IC3 = Asynchronous SRAM 512K x 8: MFR: ISSI; MFR part: IS61WV5128BLL-10TLI; Temp: −40 to +85 °C; Package: TSOP II - 44pin
P22 = Header 25: Header, 25-Pin; LatestRevisionDate: 17-Jul-2002; LatestRevisionNote: Re-released for DXP Platform.; Publisher: Altium Limited
P23 P25 = Header 6: Header, 6-Pin; LatestRevisionDate: 17-Jul-2002; LatestRevisionNote: Re-released for DXP Platform.; Publisher: Altium Limited
P24 = Header 16: Header, 16-Pin; LatestRevisionDate: 17-Jul-2002; LatestRevisionNote: Re-released for DXP Platform.; Publisher: Altium Limited

## Sheet IBM_PC_ROM_BIOS.SchDoc
size A3; SheetNumber: 8; SheetTotal: 18
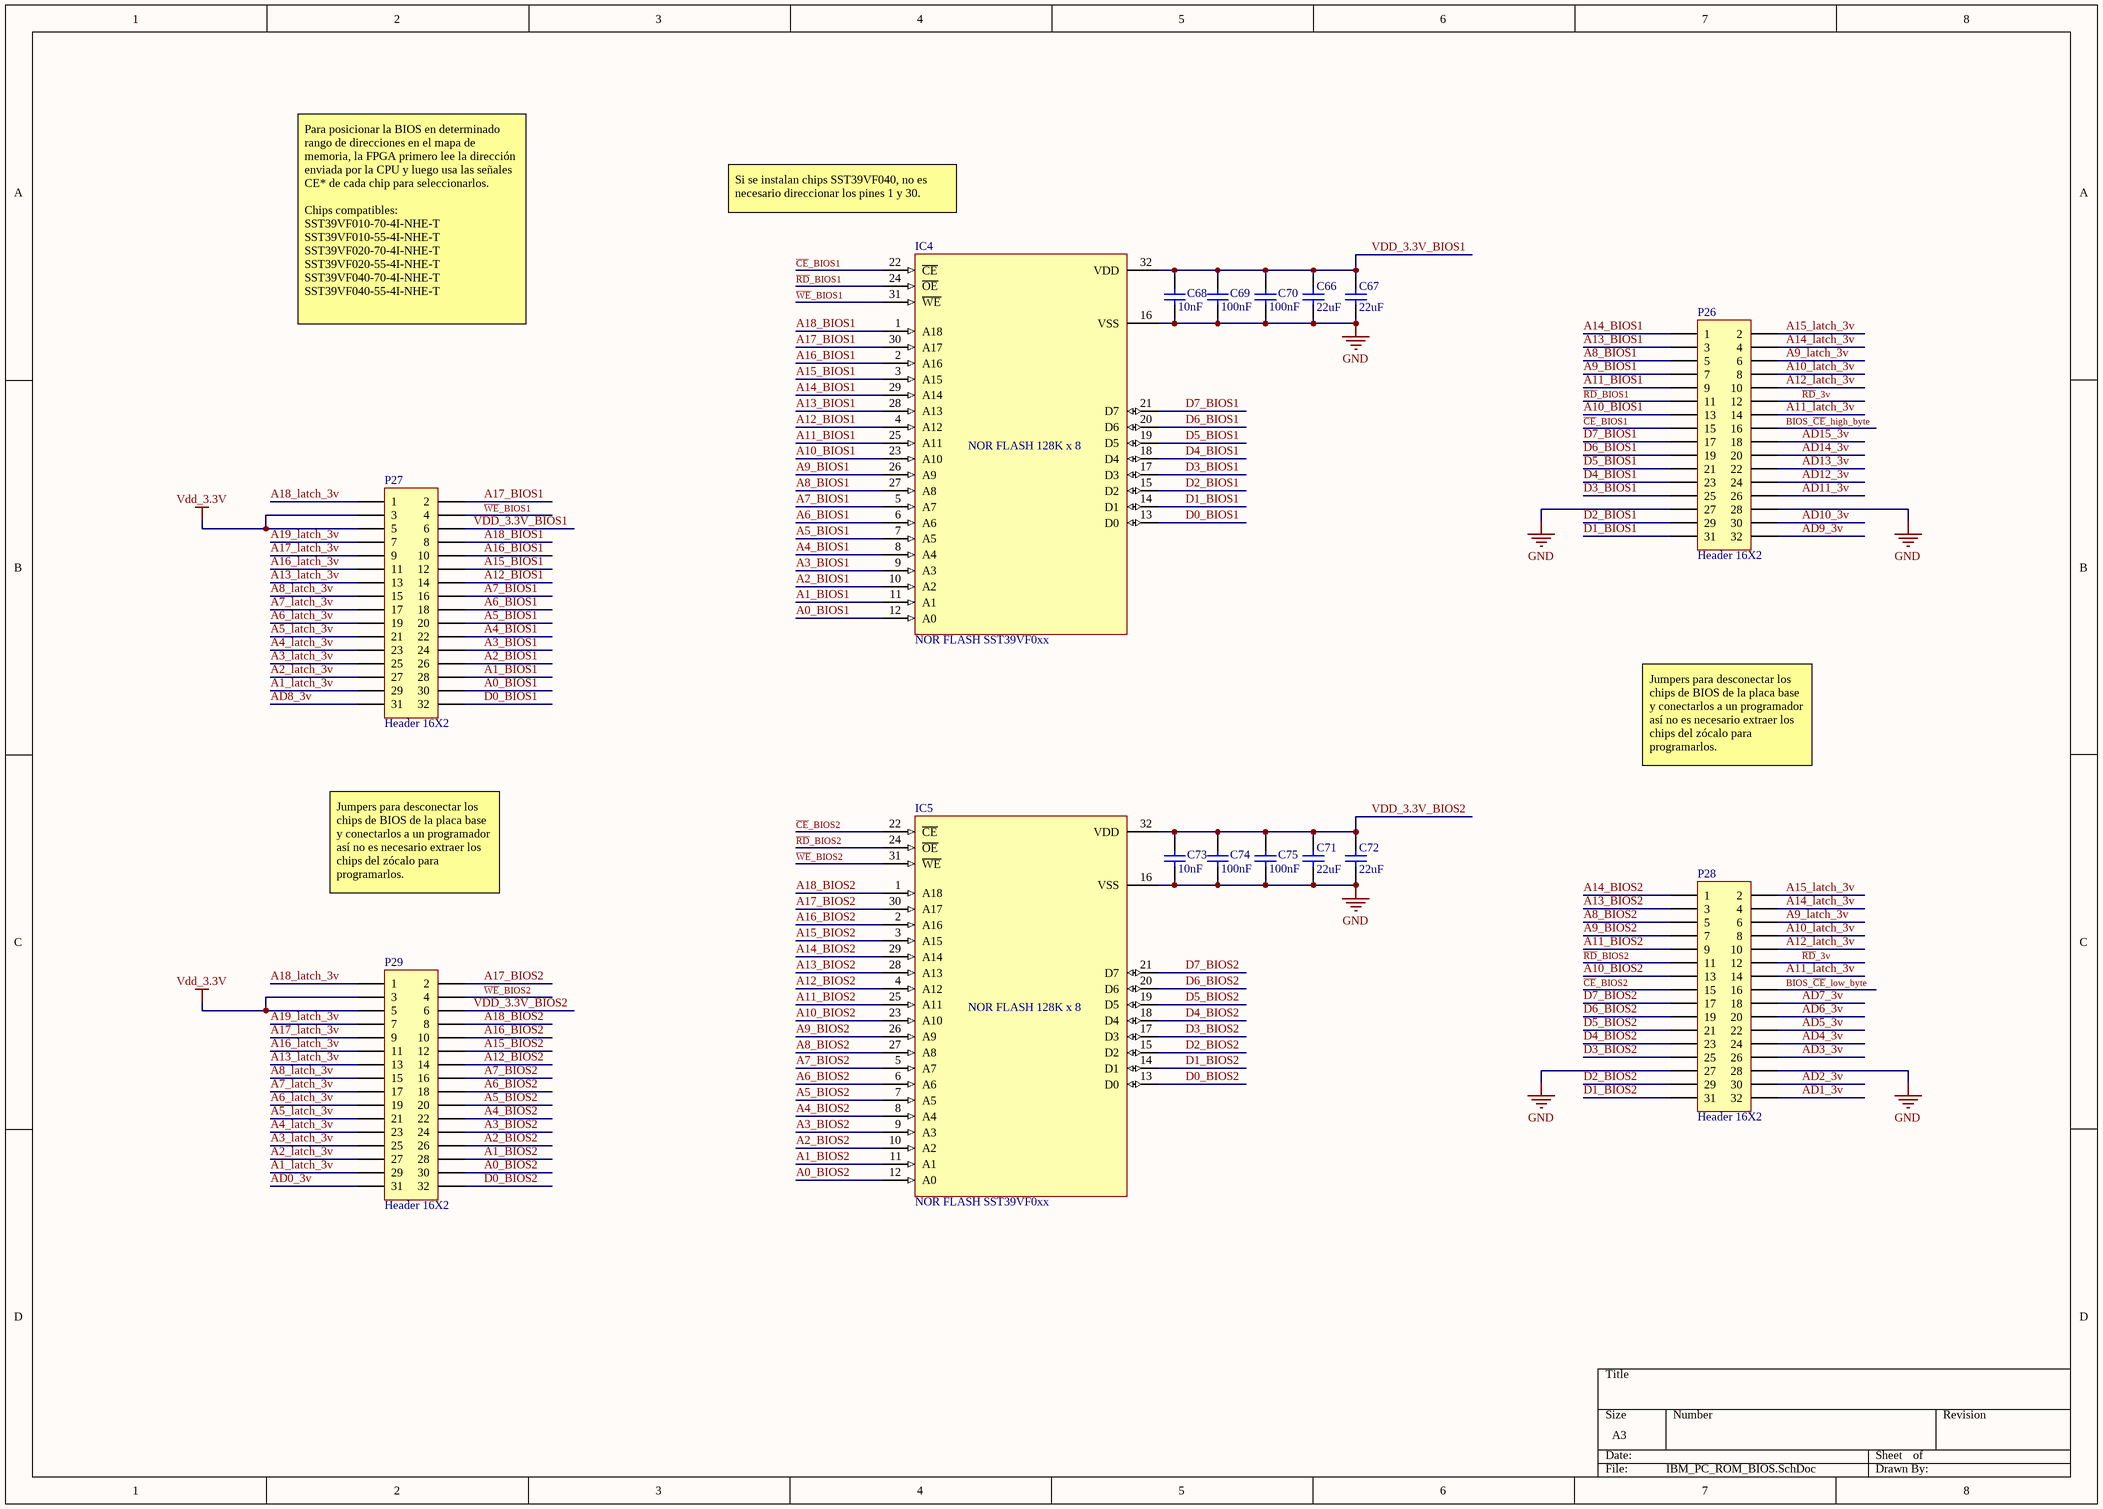
[diagram p6: IBM_PC_ROM_BIOS.SchDoc]

### Parts
C66  value 22uF  [capacitor 0603]  (hidden comment: ceramic capacitor)
C67  value 22uF  [capacitor 0603]  (hidden comment: ceramic capacitor)
C68  value 10nF  [capacitor 0603]  (hidden comment: Ceramic capacitor)
C69  value 100nF  [capacitor 0603]  (hidden comment: Ceramic capacitor)
C70  value 100nF  [capacitor 0603]  (hidden comment: Ceramic capacitor)
C71  value 22uF  [capacitor 0603]  (hidden comment: ceramic capacitor)
C72  value 22uF  [capacitor 0603]  (hidden comment: ceramic capacitor)
C73  value 10nF  [capacitor 0603]  (hidden comment: Ceramic capacitor)
C74  value 100nF  [capacitor 0603]  (hidden comment: Ceramic capacitor)
C75  value 100nF  [capacitor 0603]  (hidden comment: Ceramic capacitor)
IC4  NOR FLASH SST39VF0xx  [PLCC 32-pin]
IC5  NOR FLASH SST39VF0xx  [PLCC 32-pin]
P26  Header 16X2  [HDR2X16]
P27  Header 16X2  [HDR2X16]
P28  Header 16X2  [HDR2X16]
P29  Header 16X2  [HDR2X16]

### Nets
GND: C66.1 C67.1 C68.1 C69.1 C70.1 C71.1 C72.1 C73.1 C74.1 C75.1 IC4.16(VSS) IC5.16(VSS) P26.27 P26.28 P28.27 P28.28
Vdd_3.3V: P27.3 P27.5 P29.3 P29.5
A0_BIOS1: IC4.12(A0) P27.30
A0_BIOS2: IC5.12(A0) P29.30
A1_BIOS1: IC4.11(A1) P27.28
A1_BIOS2: IC5.11(A1) P29.28
A1_latch_3v: P27.29 P29.29
A2_BIOS1: IC4.10(A2) P27.26
A2_BIOS2: IC5.10(A2) P29.26
A2_latch_3v: P27.27 P29.27
A3_BIOS1: IC4.9(A3) P27.24
A3_BIOS2: IC5.9(A3) P29.24
A3_latch_3v: P27.25 P29.25
A4_BIOS1: IC4.8(A4) P27.22
A4_BIOS2: IC5.8(A4) P29.22
A4_latch_3v: P27.23 P29.23
A5_BIOS1: IC4.7(A5) P27.20
A5_BIOS2: IC5.7(A5) P29.20
A5_latch_3v: P27.21 P29.21
A6_BIOS1: IC4.6(A6) P27.18
A6_BIOS2: IC5.6(A6) P29.18
A6_latch_3v: P27.19 P29.19
A7_BIOS1: IC4.5(A7) P27.16
A7_BIOS2: IC5.5(A7) P29.16
A7_latch_3v: P27.17 P29.17
A8_BIOS1: IC4.27(A8) P26.5
A8_BIOS2: IC5.27(A8) P28.5
A8_latch_3v: P27.15 P29.15
A9_BIOS1: IC4.26(A9) P26.7
A9_BIOS2: IC5.26(A9) P28.7
A9_latch_3v: P26.6 P28.6
A10_BIOS1: IC4.23(A10) P26.13
A10_BIOS2: IC5.23(A10) P28.13
A10_latch_3v: P26.8 P28.8
A11_BIOS1: IC4.25(A11) P26.9
A11_BIOS2: IC5.25(A11) P28.9
A11_latch_3v: P26.14 P28.14
A12_BIOS1: IC4.4(A12) P27.14
A12_BIOS2: IC5.4(A12) P29.14
A12_latch_3v: P26.10 P28.10
A13_BIOS1: IC4.28(A13) P26.3
A13_BIOS2: IC5.28(A13) P28.3
A13_latch_3v: P27.13 P29.13
A14_BIOS1: IC4.29(A14) P26.1
A14_BIOS2: IC5.29(A14) P28.1
A14_latch_3v: P26.4 P28.4
A15_BIOS1: IC4.3(A15) P27.12
A15_BIOS2: IC5.3(A15) P29.12
A15_latch_3v: P26.2 P28.2
A16_BIOS1: IC4.2(A16) P27.10
A16_BIOS2: IC5.2(A16) P29.10
A16_latch_3v: P27.11 P29.11
A17_BIOS1: IC4.30(A17) P27.2
A17_BIOS2: IC5.30(A17) P29.2
A17_latch_3v: P27.9 P29.9
A18_BIOS1: IC4.1(A18) P27.8
A18_BIOS2: IC5.1(A18) P29.8
A18_latch_3v: P27.1 P29.1
A19_latch_3v: P27.7 P29.7
AD0_3v: P29.31
AD1_3v: P28.32
AD2_3v: P28.30
AD3_3v: P28.26
AD4_3v: P28.24
AD5_3v: P28.22
AD6_3v: P28.20
AD7_3v: P28.18
AD8_3v: P27.31
AD9_3v: P26.32
AD10_3v: P26.30
AD11_3v: P26.26
AD12_3v: P26.24
AD13_3v: P26.22
AD14_3v: P26.20
AD15_3v: P26.18
BIOS_~{CE}_high_byte: P26.16
BIOS_~{CE}_low_byte: P28.16
~{CE}_BIOS1: IC4.22(~{CE}) P26.15
~{CE}_BIOS2: IC5.22(~{CE}) P28.15
D0_BIOS1: IC4.13(D0) P27.32
D0_BIOS2: IC5.13(D0) P29.32
D1_BIOS1: IC4.14(D1) P26.31
D1_BIOS2: IC5.14(D1) P28.31
D2_BIOS1: IC4.15(D2) P26.29
D2_BIOS2: IC5.15(D2) P28.29
D3_BIOS1: IC4.17(D3) P26.25
D3_BIOS2: IC5.17(D3) P28.25
D4_BIOS1: IC4.18(D4) P26.23
D4_BIOS2: IC5.18(D4) P28.23
D5_BIOS1: IC4.19(D5) P26.21
D5_BIOS2: IC5.19(D5) P28.21
D6_BIOS1: IC4.20(D6) P26.19
D6_BIOS2: IC5.20(D6) P28.19
D7_BIOS1: IC4.21(D7) P26.17
D7_BIOS2: IC5.21(D7) P28.17
~{RD}_3v: P26.12 P28.12
~{RD}_BIOS1: IC4.24(~{OE}) P26.11
~{RD}_BIOS2: IC5.24(~{OE}) P28.11
VDD_3.3V_BIOS1: C66.2 C67.2 C68.2 C69.2 C70.2 IC4.32(VDD) P27.6
VDD_3.3V_BIOS2: C71.2 C72.2 C73.2 C74.2 C75.2 IC5.32(VDD) P29.6
~{WE}_BIOS1: IC4.31(~{WE}) P27.4
~{WE}_BIOS2: IC5.31(~{WE}) P29.4

### Notes on the sheet
- Si se instalan chips SST39VF040, no es necesario direccionar los pines 1 y 30.
- Para posicionar la BIOS en determinado rango de direcciones en el mapa de memoria, la FPGA primero lee la dirección enviada por la CPU y luego usa las señales CE* de cada chip para seleccionarlos.
  Chips compatibles:
  SST39VF010-70-4I-NHE-T
  SST39VF010-55-4I-NHE-T
  SST39VF020-70-4I-NHE-T
  SST39VF020-55-4I-NHE-T
  SST39VF040-70-4I-NHE-T
  SST39VF040-55-4I-NHE-T
- Jumpers para desconectar los chips de BIOS de la placa base y conectarlos a un programador así no es necesario extraer los chips del zócalo para programarlos.
- (in symbol NOR FLASH SST39VF0xx) NOR FLASH 128K x 8

### Library data of the parts
C66 C67 C71 C72 = ceramic capacitor: Multilayer ceramic capacitor; V: 6.3; LCSC part: C59461; Package: 0603
C68-C70 C73-C75 = Ceramic capacitor: Multilayer ceramic capacitor; V: 50; Package: 0603
  C68 C73: LCSC part: C1591
  C69 C70 C74 C75: LCSC part: C14663
IC4 IC5 = NOR FLASH SST39VF0xx: Parallel NOR FLASH SST39VF0xx
P26-P29 = Header 16X2: Header, 16-Pin, Dual row; LatestRevisionDate: 17-Jul-2002; LatestRevisionNote: Re-released for DXP Platform.; Publisher: Altium Limited

## Sheet pc_data_bus_leds.SchDoc
size A3; SheetNumber: 9; SheetTotal: 18
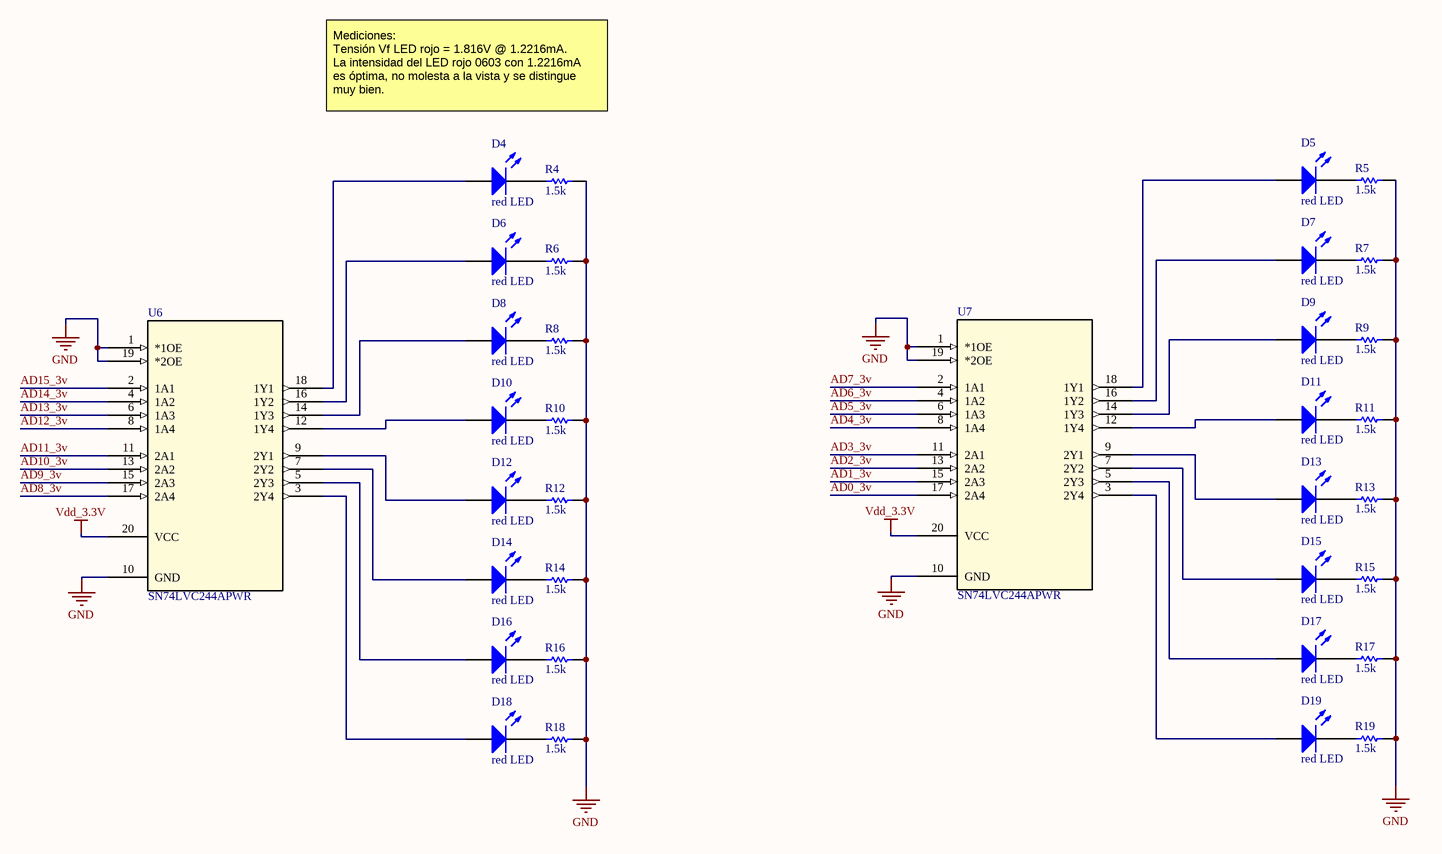
[diagram p7: pc_data_bus_leds.SchDoc]

### Parts
D4  red LED  [led 0603 clear]
D5  red LED  [led 0603 clear]
D6  red LED  [led 0603 clear]
D7  red LED  [led 0603 clear]
D8  red LED  [led 0603 clear]
D9  red LED  [led 0603 clear]
D10  red LED  [led 0603 clear]
D11  red LED  [led 0603 clear]
D12  red LED  [led 0603 clear]
D13  red LED  [led 0603 clear]
D14  red LED  [led 0603 clear]
D15  red LED  [led 0603 clear]
D16  red LED  [led 0603 clear]
D17  red LED  [led 0603 clear]
D18  red LED  [led 0603 clear]
D19  red LED  [led 0603 clear]
R4  value 1.5k  [resistor 0603]  (hidden comment: resistor)
R5  value 1.5k  [resistor 0603]  (hidden comment: resistor)
R6  value 1.5k  [resistor 0603]  (hidden comment: resistor)
R7  value 1.5k  [resistor 0603]  (hidden comment: resistor)
R8  value 1.5k  [resistor 0603]  (hidden comment: resistor)
R9  value 1.5k  [resistor 0603]  (hidden comment: resistor)
R10  value 1.5k  [resistor 0603]  (hidden comment: resistor)
R11  value 1.5k  [resistor 0603]  (hidden comment: resistor)
R12  value 1.5k  [resistor 0603]  (hidden comment: resistor)
R13  value 1.5k  [resistor 0603]  (hidden comment: resistor)
R14  value 1.5k  [resistor 0603]  (hidden comment: resistor)
R15  value 1.5k  [resistor 0603]  (hidden comment: resistor)
R16  value 1.5k  [resistor 0603]  (hidden comment: resistor)
R17  value 1.5k  [resistor 0603]  (hidden comment: resistor)
R18  value 1.5k  [resistor 0603]  (hidden comment: resistor)
R19  value 1.5k  [resistor 0603]  (hidden comment: resistor)
U6  SN74LVC244APWR  [PW20]
U7  SN74LVC244APWR  [PW20]

### Nets
GND: R4.1 R5.1 R6.1 R7.1 R8.1 R9.1 R10.1 R11.1 R12.1 R13.1 R14.1 R15.1 R16.1 R17.1 R18.1 R19.1 U6.1(*1OE) U6.10(GND) U6.19(*2OE) U7.1(*1OE) U7.10(GND) U7.19(*2OE)
Vdd_3.3V: U6.20(VCC) U7.20(VCC)
AD0_3v: U7.17(2A4)
AD1_3v: U7.15(2A3)
AD2_3v: U7.13(2A2)
AD3_3v: U7.11(2A1)
AD4_3v: U7.8(1A4)
AD5_3v: U7.6(1A3)
AD6_3v: U7.4(1A2)
AD7_3v: U7.2(1A1)
AD8_3v: U6.17(2A4)
AD9_3v: U6.15(2A3)
AD10_3v: U6.13(2A2)
AD11_3v: U6.11(2A1)
AD12_3v: U6.8(1A4)
AD13_3v: U6.6(1A3)
AD14_3v: U6.4(1A2)
AD15_3v: U6.2(1A1)
NetD4_1: D4.1(A) U6.18(1Y1)
NetD4_2: D4.2(K) R4.2
NetD5_1: D5.1(A) U7.18(1Y1)
NetD5_2: D5.2(K) R5.2
NetD6_1: D6.1(A) U6.16(1Y2)
NetD6_2: D6.2(K) R6.2
NetD7_1: D7.1(A) U7.16(1Y2)
NetD7_2: D7.2(K) R7.2
NetD8_1: D8.1(A) U6.14(1Y3)
NetD8_2: D8.2(K) R8.2
NetD9_1: D9.1(A) U7.14(1Y3)
NetD9_2: D9.2(K) R9.2
NetD10_1: D10.1(A) U6.12(1Y4)
NetD10_2: D10.2(K) R10.2
NetD11_1: D11.1(A) U7.12(1Y4)
NetD11_2: D11.2(K) R11.2
NetD12_1: D12.1(A) U6.9(2Y1)
NetD12_2: D12.2(K) R12.2
NetD13_1: D13.1(A) U7.9(2Y1)
NetD13_2: D13.2(K) R13.2
NetD14_1: D14.1(A) U6.7(2Y2)
NetD14_2: D14.2(K) R14.2
NetD15_1: D15.1(A) U7.7(2Y2)
NetD15_2: D15.2(K) R15.2
NetD16_1: D16.1(A) U6.5(2Y3)
NetD16_2: D16.2(K) R16.2
NetD17_1: D17.1(A) U7.5(2Y3)
NetD17_2: D17.2(K) R17.2
NetD18_1: D18.1(A) U6.3(2Y4)
NetD18_2: D18.2(K) R18.2
NetD19_1: D19.1(A) U7.3(2Y4)
NetD19_2: D19.2(K) R19.2

### Notes on the sheet
- Mediciones:
  Tensión Vf LED rojo = 1.816V @ 1.2216mA.
  La intensidad del LED rojo 0603 con 1.2216mA
  es óptima, no molesta a la vista y se distingue
  muy bien.

### Library data of the parts
D4-D19 = LED2: Red LED 0603; Package: 0603 - 3.2X1.6X1.1; LCSC part: C2286
U6 U7 = SN74LVC244APWR: 8-ch, 1.65-V to 3.6-V buffers with 3-state outputs 20-TSSOP -40 to 125; Manufacturer_Name: Texas Instruments; Copyright: Copyright (C) 2026 Ultra Librarian. All rights reserved.; Manufacturer_Part_Number: SN74LVC244APWR; Datasheet: https://www.ti.com/lit/gpn/sn74lvc244a; RefDes: RefDes; Type: Type
R4-R19 = resistor: LCSC part: C22843; Package: 0603

## Sheet pc_data_bus_input_switches.SchDoc
size A3; SheetNumber: 10; SheetTotal: 18
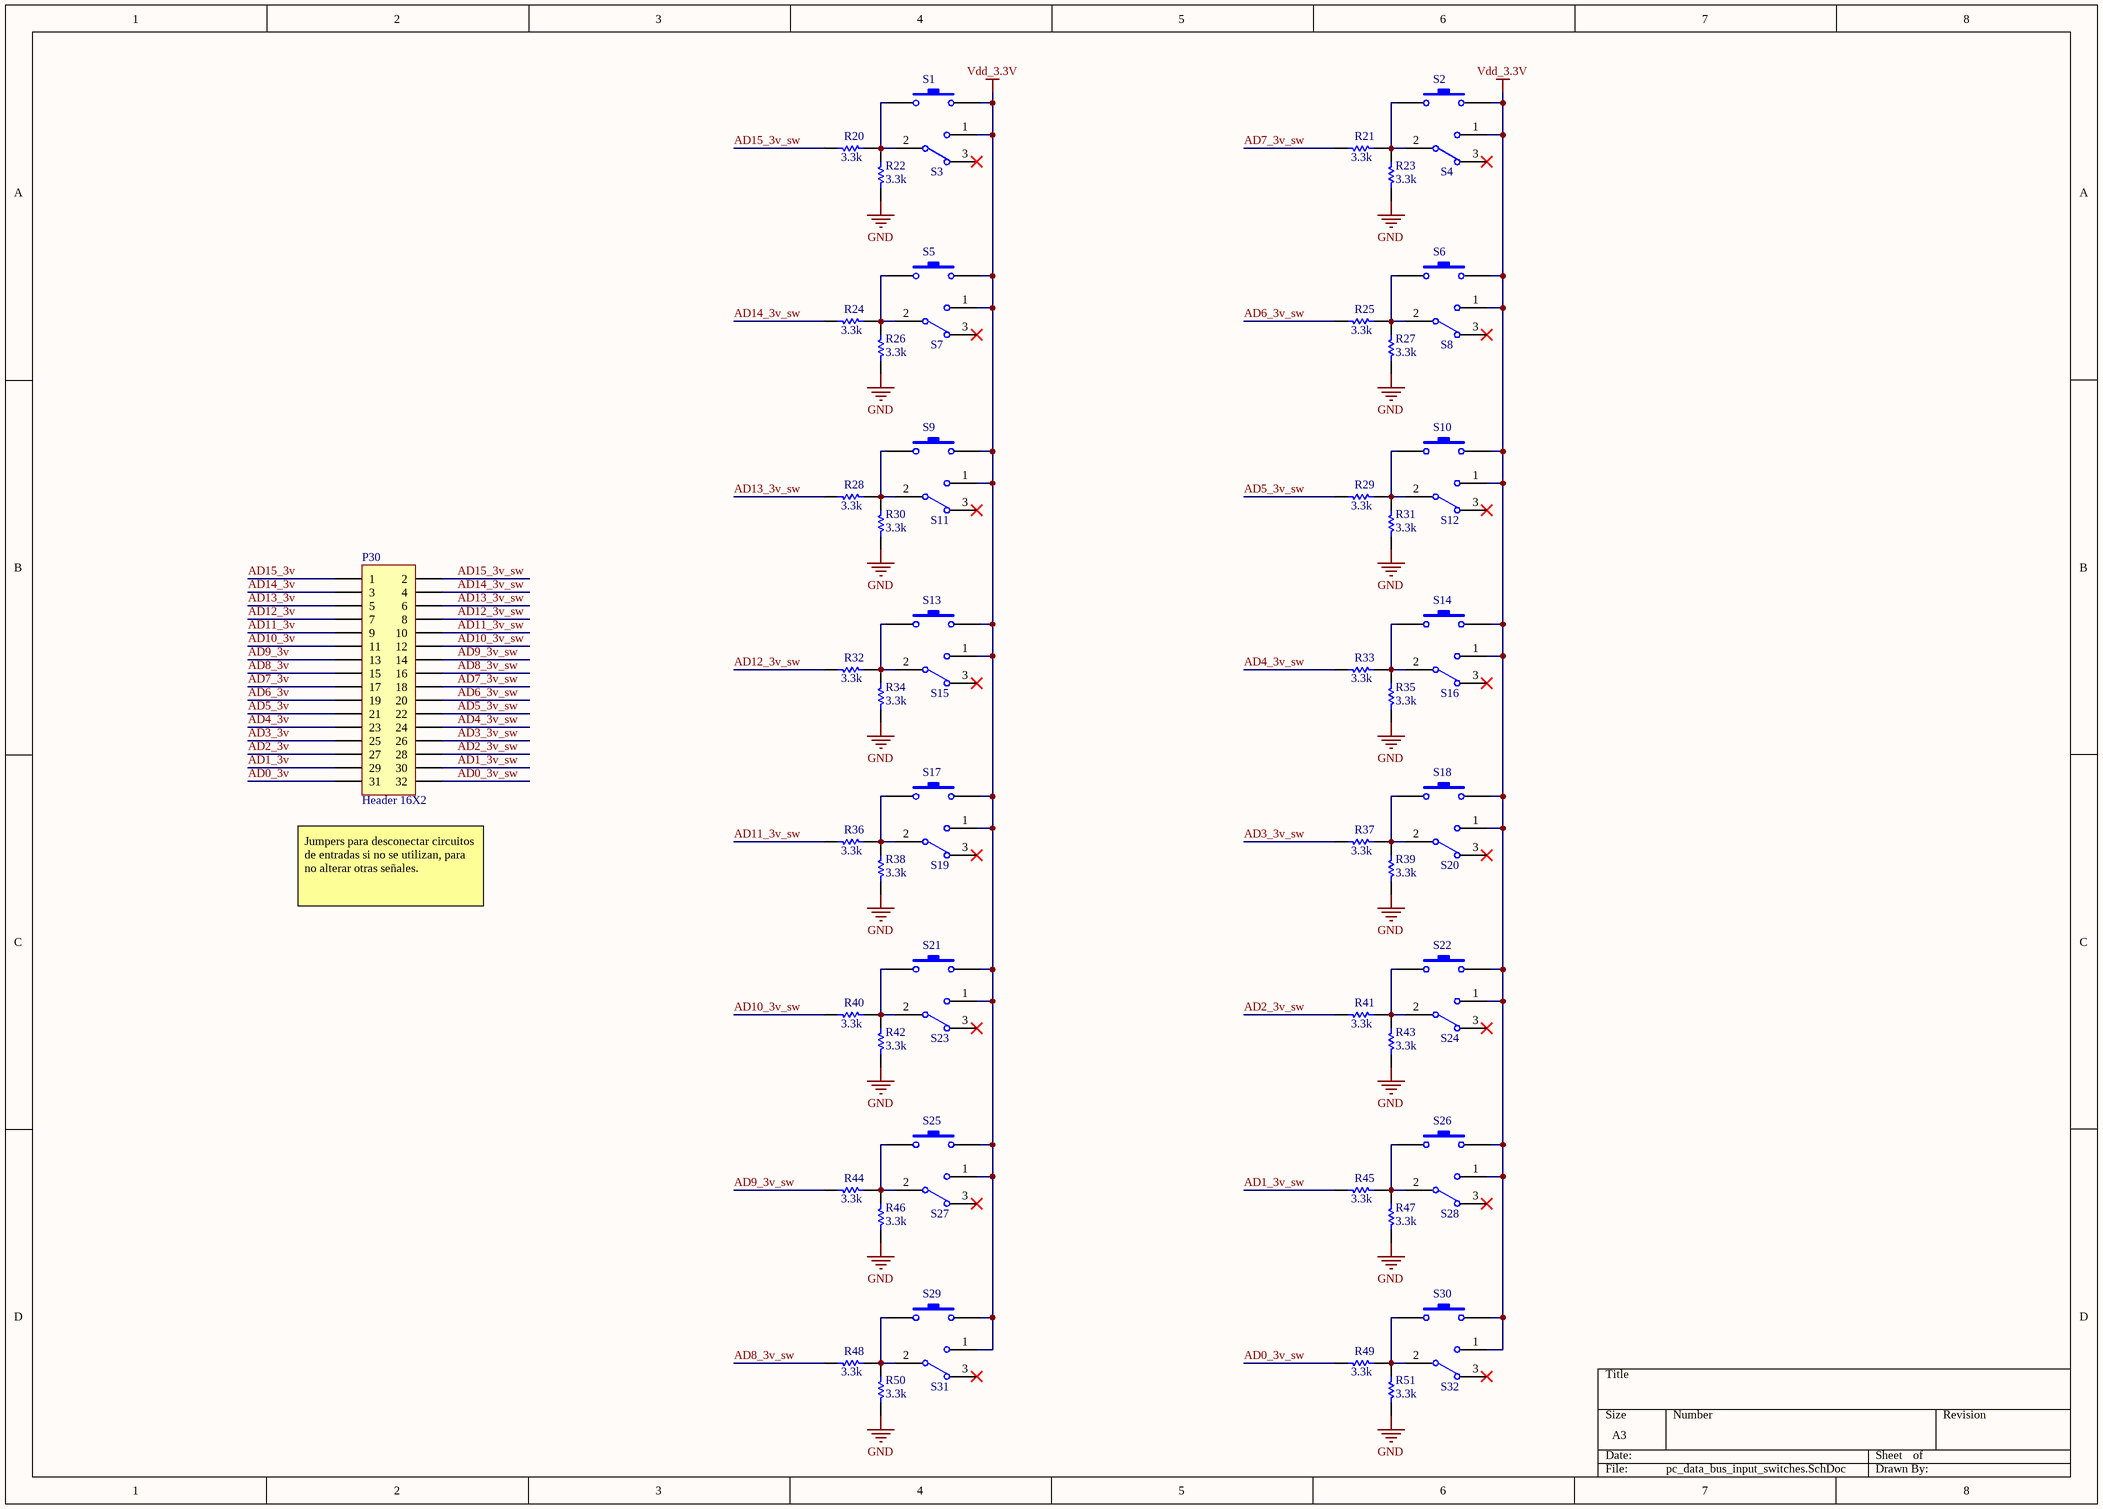
[diagram p8: pc_data_bus_input_switches.SchDoc]

### Parts
P30  Header 16X2  [HDR2X16]
R20  value 3.3k  [resistor 0603]  (hidden comment: resistor)
R21  value 3.3k  [resistor 0603]  (hidden comment: resistor)
R22  value 3.3k  [resistor 0603]  (hidden comment: resistor)
R23  value 3.3k  [resistor 0603]  (hidden comment: resistor)
R24  value 3.3k  [resistor 0603]  (hidden comment: resistor)
R25  value 3.3k  [resistor 0603]  (hidden comment: resistor)
R26  value 3.3k  [resistor 0603]  (hidden comment: resistor)
R27  value 3.3k  [resistor 0603]  (hidden comment: resistor)
R28  value 3.3k  [resistor 0603]  (hidden comment: resistor)
R29  value 3.3k  [resistor 0603]  (hidden comment: resistor)
R30  value 3.3k  [resistor 0603]  (hidden comment: resistor)
R31  value 3.3k  [resistor 0603]  (hidden comment: resistor)
R32  value 3.3k  [resistor 0603]  (hidden comment: resistor)
R33  value 3.3k  [resistor 0603]  (hidden comment: resistor)
R34  value 3.3k  [resistor 0603]  (hidden comment: resistor)
R35  value 3.3k  [resistor 0603]  (hidden comment: resistor)
R36  value 3.3k  [resistor 0603]  (hidden comment: resistor)
R37  value 3.3k  [resistor 0603]  (hidden comment: resistor)
R38  value 3.3k  [resistor 0603]  (hidden comment: resistor)
R39  value 3.3k  [resistor 0603]  (hidden comment: resistor)
R40  value 3.3k  [resistor 0603]  (hidden comment: resistor)
R41  value 3.3k  [resistor 0603]  (hidden comment: resistor)
R42  value 3.3k  [resistor 0603]  (hidden comment: resistor)
R43  value 3.3k  [resistor 0603]  (hidden comment: resistor)
R44  value 3.3k  [resistor 0603]  (hidden comment: resistor)
R45  value 3.3k  [resistor 0603]  (hidden comment: resistor)
R46  value 3.3k  [resistor 0603]  (hidden comment: resistor)
R47  value 3.3k  [resistor 0603]  (hidden comment: resistor)
R48  value 3.3k  [resistor 0603]  (hidden comment: resistor)
R49  value 3.3k  [resistor 0603]  (hidden comment: resistor)
R50  value 3.3k  [resistor 0603]  (hidden comment: resistor)
R51  value 3.3k  [resistor 0603]  (hidden comment: resistor)
S1  Button  [Tact switch]  (value not drawn)
S2  Button  [Tact switch]  (value not drawn)
S3  SW-SPDT  [Slide switch 2mm pitch]  (value not drawn)
S4  SW-SPDT  [Slide switch 2mm pitch]  (value not drawn)
S5  Button  [Tact switch]  (value not drawn)
S6  Button  [Tact switch]  (value not drawn)
S7  SW-SPDT  [Slide switch 2mm pitch]  (value not drawn)
S8  SW-SPDT  [Slide switch 2mm pitch]  (value not drawn)
S9  Button  [Tact switch]  (value not drawn)
S10  Button  [Tact switch]  (value not drawn)
S11  SW-SPDT  [Slide switch 2mm pitch]  (value not drawn)
S12  SW-SPDT  [Slide switch 2mm pitch]  (value not drawn)
S13  Button  [Tact switch]  (value not drawn)
S14  Button  [Tact switch]  (value not drawn)
S15  SW-SPDT  [Slide switch 2mm pitch]  (value not drawn)
S16  SW-SPDT  [Slide switch 2mm pitch]  (value not drawn)
S17  Button  [Tact switch]  (value not drawn)
S18  Button  [Tact switch]  (value not drawn)
S19  SW-SPDT  [Slide switch 2mm pitch]  (value not drawn)
S20  SW-SPDT  [Slide switch 2mm pitch]  (value not drawn)
S21  Button  [Tact switch]  (value not drawn)
S22  Button  [Tact switch]  (value not drawn)
S23  SW-SPDT  [Slide switch 2mm pitch]  (value not drawn)
S24  SW-SPDT  [Slide switch 2mm pitch]  (value not drawn)
S25  Button  [Tact switch]  (value not drawn)
S26  Button  [Tact switch]  (value not drawn)
S27  SW-SPDT  [Slide switch 2mm pitch]  (value not drawn)
S28  SW-SPDT  [Slide switch 2mm pitch]  (value not drawn)
S29  Button  [Tact switch]  (value not drawn)
S30  Button  [Tact switch]  (value not drawn)
S31  SW-SPDT  [Slide switch 2mm pitch]  (value not drawn)
S32  SW-SPDT  [Slide switch 2mm pitch]  (value not drawn)

### Nets
GND: R22.2 R23.2 R26.2 R27.2 R30.2 R31.2 R34.2 R35.2 R38.2 R39.2 R42.2 R43.2 R46.2 R47.2 R50.2 R51.2
Vdd_3.3V: S1.2 S2.2 S3.1 S4.1 S5.2 S6.2 S7.1 S8.1 S9.2 S10.2 S11.1 S12.1 S13.2 S14.2 S15.1 S16.1 S17.2 S18.2 S19.1 S20.1 S21.2 S22.2 S23.1 S24.1 S25.2 S26.2 S27.1 S28.1 S29.2 S30.2 S31.1 S32.1
AD0_3v: P30.31
AD0_3v_sw: P30.32 R49.1
AD1_3v: P30.29
AD1_3v_sw: P30.30 R45.1
AD2_3v: P30.27
AD2_3v_sw: P30.28 R41.1
AD3_3v: P30.25
AD3_3v_sw: P30.26 R37.1
AD4_3v: P30.23
AD4_3v_sw: P30.24 R33.1
AD5_3v: P30.21
AD5_3v_sw: P30.22 R29.1
AD6_3v: P30.19
AD6_3v_sw: P30.20 R25.1
AD7_3v: P30.17
AD7_3v_sw: P30.18 R21.1
AD8_3v: P30.15
AD8_3v_sw: P30.16 R48.1
AD9_3v: P30.13
AD9_3v_sw: P30.14 R44.1
AD10_3v: P30.11
AD10_3v_sw: P30.12 R40.1
AD11_3v: P30.9
AD11_3v_sw: P30.10 R36.1
AD12_3v: P30.7
AD12_3v_sw: P30.8 R32.1
AD13_3v: P30.5
AD13_3v_sw: P30.6 R28.1
AD14_3v: P30.3
AD14_3v_sw: P30.4 R24.1
AD15_3v: P30.1
AD15_3v_sw: P30.2 R20.1
NetR20_2: R20.2 R22.1 S1.1 S3.2
NetR21_2: R21.2 R23.1 S2.1 S4.2
NetR24_2: R24.2 R26.1 S5.1 S7.2
NetR25_2: R25.2 R27.1 S6.1 S8.2
NetR28_2: R28.2 R30.1 S9.1 S11.2
NetR29_2: R29.2 R31.1 S10.1 S12.2
NetR32_2: R32.2 R34.1 S13.1 S15.2
NetR33_2: R33.2 R35.1 S14.1 S16.2
NetR36_2: R36.2 R38.1 S17.1 S19.2
NetR37_2: R37.2 R39.1 S18.1 S20.2
NetR40_2: R40.2 R42.1 S21.1 S23.2
NetR41_2: R41.2 R43.1 S22.1 S24.2
NetR44_2: R44.2 R46.1 S25.1 S27.2
NetR45_2: R45.2 R47.1 S26.1 S28.2
NetR48_2: R48.2 R50.1 S29.1 S31.2
NetR49_2: R49.2 R51.1 S30.1 S32.2

Not connected (* = marked no-connect by the designer): S3 3*; S4 3*; S7 3*; S8 3*; S11 3*; S12 3*; S15 3*; S16 3*; S19 3*; S20 3*; S23 3*; S24 3*; S27 3*; S28 3*; S31 3*; S32 3*

### Notes on the sheet
- (near P30) Jumpers para desconectar circuitos de entradas si no se utilizan, para no alterar otras señales.

### Library data of the parts
P30 = Header 16X2: Header, 16-Pin, Dual row; LatestRevisionDate: 17-Jul-2002; LatestRevisionNote: Re-released for DXP Platform.; Publisher: Altium Limited
S1 S2 S5 S6 S9 S10 S13 S14 S17 S18 S21 S22 S25 S26 S29 S30 = SW-PB: Switch; pin to pad: 2>3
S3 S4 S7 S8 S11 S12 S15 S16 S19 S20 S23 S24 S27 S28 S31 S32 = SW-SPDT: SPDT Subminiature Toggle Switch, Right Angle Mounting, Vertical Actuation; Published: 24-Mar-1999; LatestRevisionDate: 17-Dec-2003; LatestRevisionNote: Schematic revised, PCB Footprint replaced.; DatasheetVersion: 05-Dec-2000; PackageReference: TL36WW15050; Publisher: Altium Limited; PackageDescription: Switch; 4 Leads; ComponentLink1Description: Manufacturer Link; ComponentLink1URL: http://www.apem.com
R20-R51 = resistor: Package: 0603

## Sheet pc_address_bus_leds.SchDoc
size A3; SheetNumber: 11; SheetTotal: 18
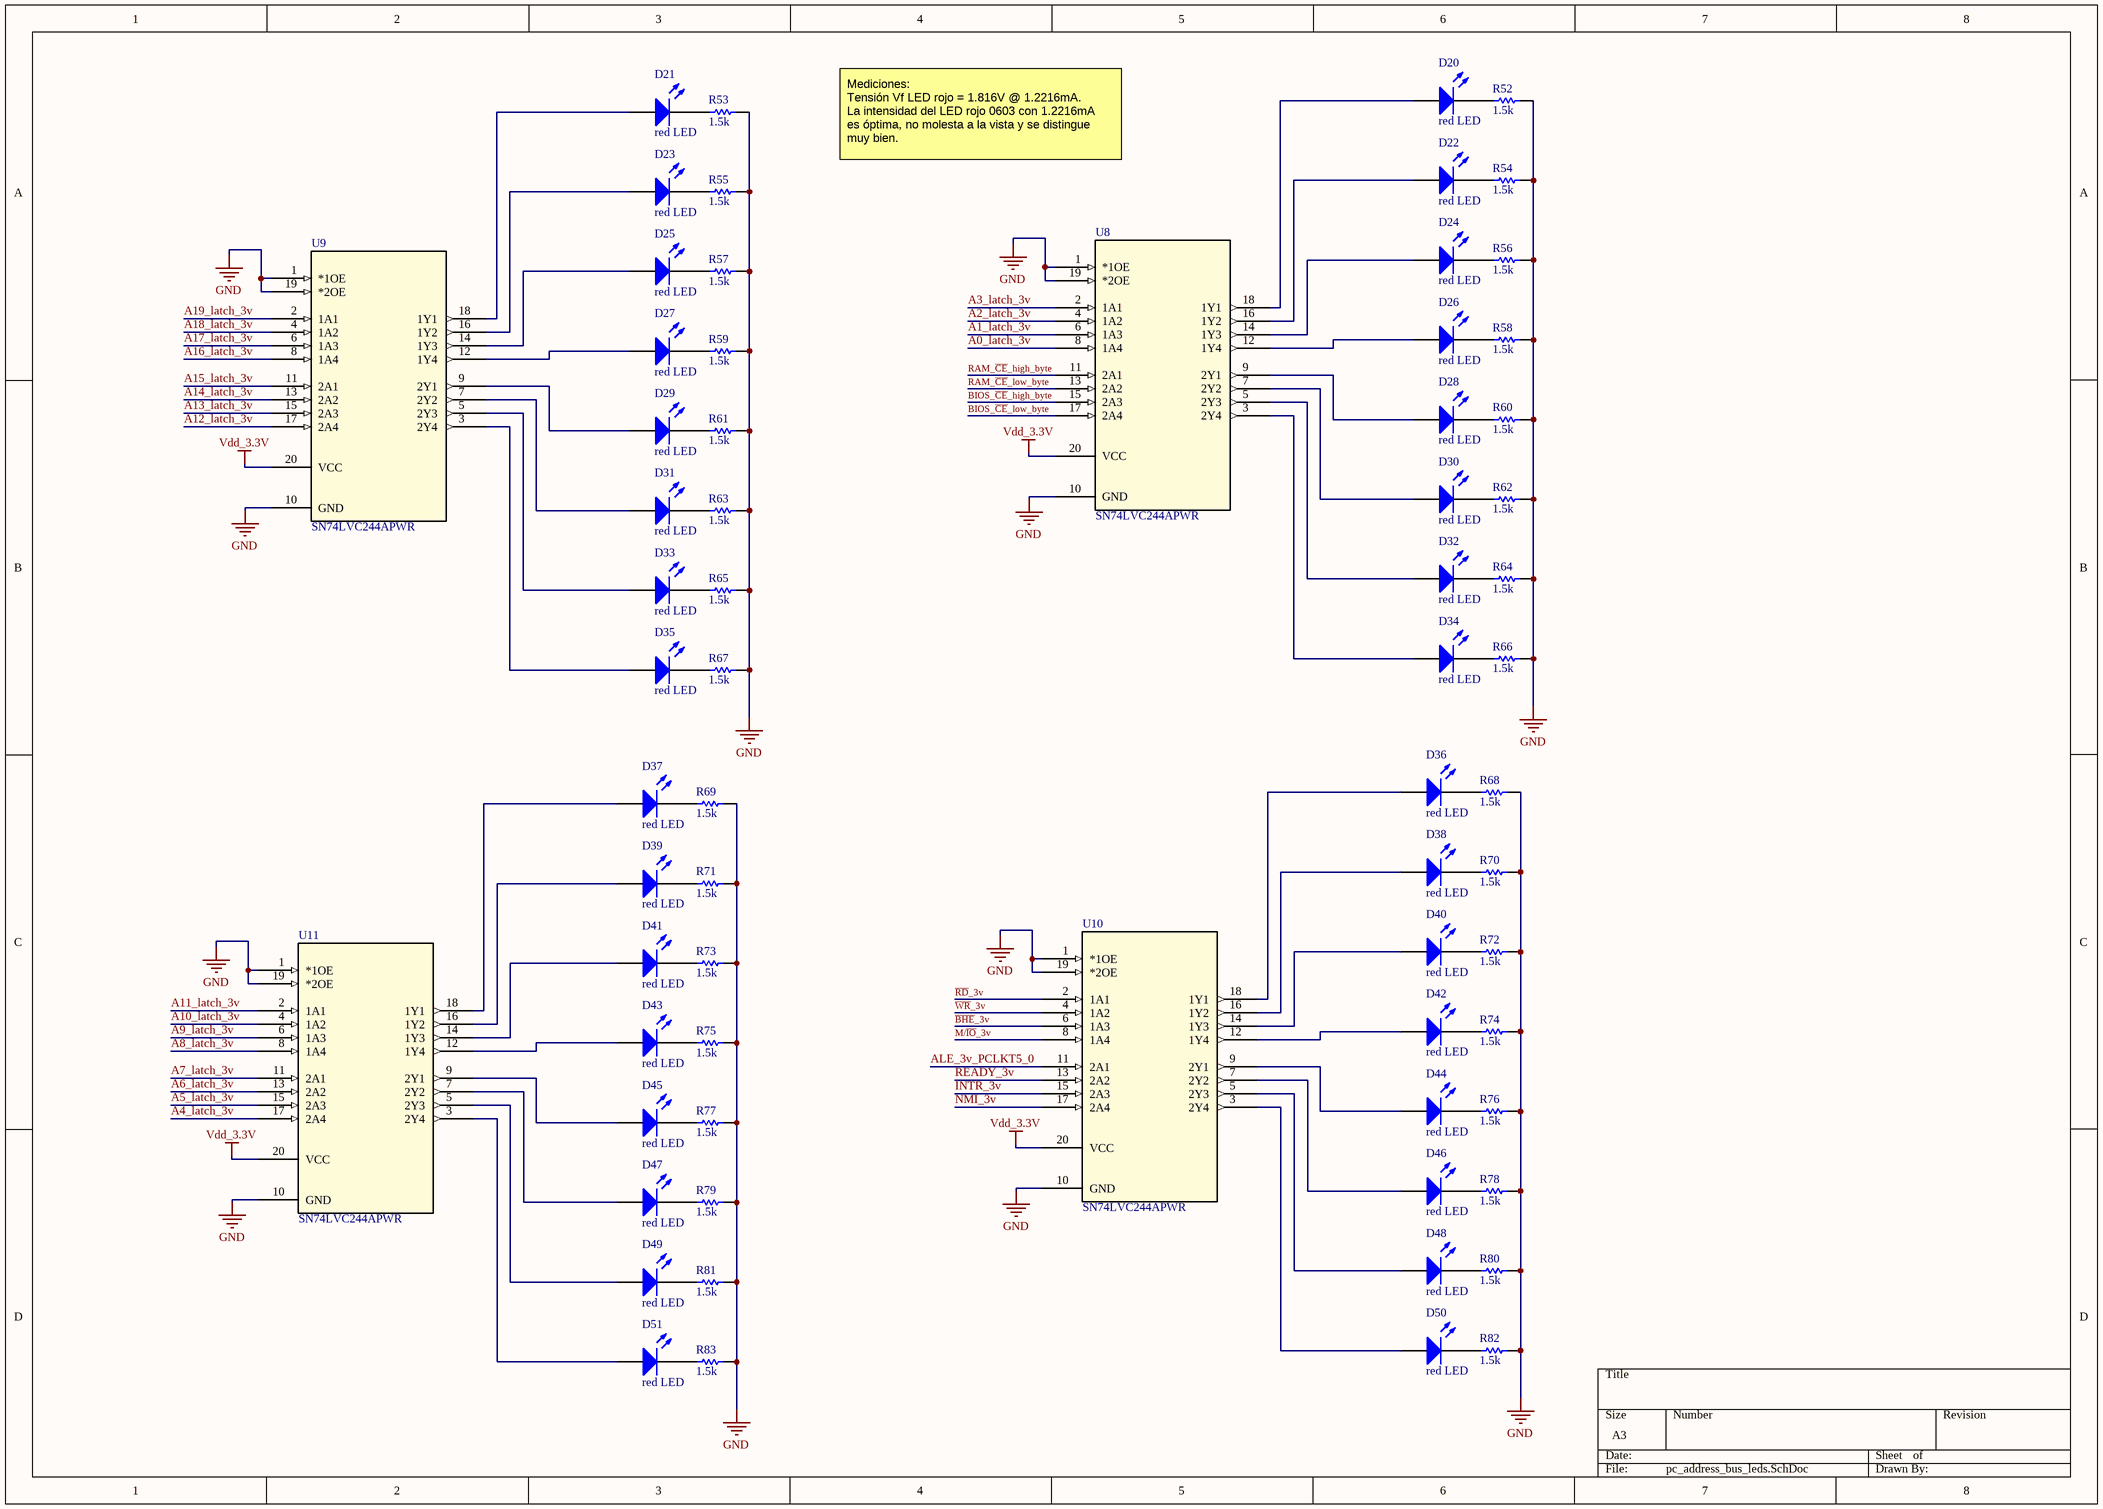
[diagram p9: pc_address_bus_leds.SchDoc]

### Parts
D20  red LED  [led 0603 clear]
D21  red LED  [led 0603 clear]
D22  red LED  [led 0603 clear]
D23  red LED  [led 0603 clear]
D24  red LED  [led 0603 clear]
D25  red LED  [led 0603 clear]
D26  red LED  [led 0603 clear]
D27  red LED  [led 0603 clear]
D28  red LED  [led 0603 clear]
D29  red LED  [led 0603 clear]
D30  red LED  [led 0603 clear]
D31  red LED  [led 0603 clear]
D32  red LED  [led 0603 clear]
D33  red LED  [led 0603 clear]
D34  red LED  [led 0603 clear]
D35  red LED  [led 0603 clear]
D36  red LED  [led 0603 clear]
D37  red LED  [led 0603 clear]
D38  red LED  [led 0603 clear]
D39  red LED  [led 0603 clear]
D40  red LED  [led 0603 clear]
D41  red LED  [led 0603 clear]
D42  red LED  [led 0603 clear]
D43  red LED  [led 0603 clear]
D44  red LED  [led 0603 clear]
D45  red LED  [led 0603 clear]
D46  red LED  [led 0603 clear]
D47  red LED  [led 0603 clear]
D48  red LED  [led 0603 clear]
D49  red LED  [led 0603 clear]
D50  red LED  [led 0603 clear]
D51  red LED  [led 0603 clear]
R52  value 1.5k  [resistor 0603]  (hidden comment: resistor)
R53  value 1.5k  [resistor 0603]  (hidden comment: resistor)
R54  value 1.5k  [resistor 0603]  (hidden comment: resistor)
R55  value 1.5k  [resistor 0603]  (hidden comment: resistor)
R56  value 1.5k  [resistor 0603]  (hidden comment: resistor)
R57  value 1.5k  [resistor 0603]  (hidden comment: resistor)
R58  value 1.5k  [resistor 0603]  (hidden comment: resistor)
R59  value 1.5k  [resistor 0603]  (hidden comment: resistor)
R60  value 1.5k  [resistor 0603]  (hidden comment: resistor)
R61  value 1.5k  [resistor 0603]  (hidden comment: resistor)
R62  value 1.5k  [resistor 0603]  (hidden comment: resistor)
R63  value 1.5k  [resistor 0603]  (hidden comment: resistor)
R64  value 1.5k  [resistor 0603]  (hidden comment: resistor)
R65  value 1.5k  [resistor 0603]  (hidden comment: resistor)
R66  value 1.5k  [resistor 0603]  (hidden comment: resistor)
R67  value 1.5k  [resistor 0603]  (hidden comment: resistor)
R68  value 1.5k  [resistor 0603]  (hidden comment: resistor)
R69  value 1.5k  [resistor 0603]  (hidden comment: resistor)
R70  value 1.5k  [resistor 0603]  (hidden comment: resistor)
R71  value 1.5k  [resistor 0603]  (hidden comment: resistor)
R72  value 1.5k  [resistor 0603]  (hidden comment: resistor)
R73  value 1.5k  [resistor 0603]  (hidden comment: resistor)
R74  value 1.5k  [resistor 0603]  (hidden comment: resistor)
R75  value 1.5k  [resistor 0603]  (hidden comment: resistor)
R76  value 1.5k  [resistor 0603]  (hidden comment: resistor)
R77  value 1.5k  [resistor 0603]  (hidden comment: resistor)
R78  value 1.5k  [resistor 0603]  (hidden comment: resistor)
R79  value 1.5k  [resistor 0603]  (hidden comment: resistor)
R80  value 1.5k  [resistor 0603]  (hidden comment: resistor)
R81  value 1.5k  [resistor 0603]  (hidden comment: resistor)
R82  value 1.5k  [resistor 0603]  (hidden comment: resistor)
R83  value 1.5k  [resistor 0603]  (hidden comment: resistor)
U8  SN74LVC244APWR  [PW20]
U9  SN74LVC244APWR  [PW20]
U10  SN74LVC244APWR  [PW20]
U11  SN74LVC244APWR  [PW20]

### Nets
GND: R52.1 R53.1 R54.1 R55.1 R56.1 R57.1 R58.1 R59.1 R60.1 R61.1 R62.1 R63.1 R64.1 R65.1 R66.1 R67.1 R68.1 R69.1 R70.1 R71.1 R72.1 R73.1 R74.1 R75.1 R76.1 R77.1 R78.1 R79.1 R80.1 R81.1 R82.1 R83.1 U8.1(*1OE) U8.10(GND) U8.19(*2OE) U9.1(*1OE) U9.10(GND) U9.19(*2OE) U10.1(*1OE) U10.10(GND) U10.19(*2OE) U11.1(*1OE) U11.10(GND) U11.19(*2OE)
Vdd_3.3V: U8.20(VCC) U9.20(VCC) U10.20(VCC) U11.20(VCC)
A0_latch_3v: U8.8(1A4)
A1_latch_3v: U8.6(1A3)
A2_latch_3v: U8.4(1A2)
A3_latch_3v: U8.2(1A1)
A4_latch_3v: U11.17(2A4)
A5_latch_3v: U11.15(2A3)
A6_latch_3v: U11.13(2A2)
A7_latch_3v: U11.11(2A1)
A8_latch_3v: U11.8(1A4)
A9_latch_3v: U11.6(1A3)
A10_latch_3v: U11.4(1A2)
A11_latch_3v: U11.2(1A1)
A12_latch_3v: U9.17(2A4)
A13_latch_3v: U9.15(2A3)
A14_latch_3v: U9.13(2A2)
A15_latch_3v: U9.11(2A1)
A16_latch_3v: U9.8(1A4)
A17_latch_3v: U9.6(1A3)
A18_latch_3v: U9.4(1A2)
A19_latch_3v: U9.2(1A1)
ALE_3v_PCLKT5_0: U10.11(2A1)
~{BHE}_3v: U10.6(1A3)
BIOS_~{CE}_high_byte: U8.15(2A3)
BIOS_~{CE}_low_byte: U8.17(2A4)
INTR_3v: U10.15(2A3)
M/~{IO}_3v: U10.8(1A4)
NMI_3v: U10.17(2A4)
~{RD}_3v: U10.2(1A1)
RAM_~{CE}_high_byte: U8.11(2A1)
RAM_~{CE}_low_byte: U8.13(2A2)
READY_3v: U10.13(2A2)
~{WR}_3v: U10.4(1A2)
NetD20_1: D20.1(A) U8.18(1Y1)
NetD20_2: D20.2(K) R52.2
NetD21_1: D21.1(A) U9.18(1Y1)
NetD21_2: D21.2(K) R53.2
NetD22_1: D22.1(A) U8.16(1Y2)
NetD22_2: D22.2(K) R54.2
NetD23_1: D23.1(A) U9.16(1Y2)
NetD23_2: D23.2(K) R55.2
NetD24_1: D24.1(A) U8.14(1Y3)
NetD24_2: D24.2(K) R56.2
NetD25_1: D25.1(A) U9.14(1Y3)
NetD25_2: D25.2(K) R57.2
NetD26_1: D26.1(A) U8.12(1Y4)
NetD26_2: D26.2(K) R58.2
NetD27_1: D27.1(A) U9.12(1Y4)
NetD27_2: D27.2(K) R59.2
NetD28_1: D28.1(A) U8.9(2Y1)
NetD28_2: D28.2(K) R60.2
NetD29_1: D29.1(A) U9.9(2Y1)
NetD29_2: D29.2(K) R61.2
NetD30_1: D30.1(A) U8.7(2Y2)
NetD30_2: D30.2(K) R62.2
NetD31_1: D31.1(A) U9.7(2Y2)
NetD31_2: D31.2(K) R63.2
NetD32_1: D32.1(A) U8.5(2Y3)
NetD32_2: D32.2(K) R64.2
NetD33_1: D33.1(A) U9.5(2Y3)
NetD33_2: D33.2(K) R65.2
NetD34_1: D34.1(A) U8.3(2Y4)
NetD34_2: D34.2(K) R66.2
NetD35_1: D35.1(A) U9.3(2Y4)
NetD35_2: D35.2(K) R67.2
NetD36_1: D36.1(A) U10.18(1Y1)
NetD36_2: D36.2(K) R68.2
NetD37_1: D37.1(A) U11.18(1Y1)
NetD37_2: D37.2(K) R69.2
NetD38_1: D38.1(A) U10.16(1Y2)
NetD38_2: D38.2(K) R70.2
NetD39_1: D39.1(A) U11.16(1Y2)
NetD39_2: D39.2(K) R71.2
NetD40_1: D40.1(A) U10.14(1Y3)
NetD40_2: D40.2(K) R72.2
NetD41_1: D41.1(A) U11.14(1Y3)
NetD41_2: D41.2(K) R73.2
NetD42_1: D42.1(A) U10.12(1Y4)
NetD42_2: D42.2(K) R74.2
NetD43_1: D43.1(A) U11.12(1Y4)
NetD43_2: D43.2(K) R75.2
NetD44_1: D44.1(A) U10.9(2Y1)
NetD44_2: D44.2(K) R76.2
NetD45_1: D45.1(A) U11.9(2Y1)
NetD45_2: D45.2(K) R77.2
NetD46_1: D46.1(A) U10.7(2Y2)
NetD46_2: D46.2(K) R78.2
NetD47_1: D47.1(A) U11.7(2Y2)
NetD47_2: D47.2(K) R79.2
NetD48_1: D48.1(A) U10.5(2Y3)
NetD48_2: D48.2(K) R80.2
NetD49_1: D49.1(A) U11.5(2Y3)
NetD49_2: D49.2(K) R81.2
NetD50_1: D50.1(A) U10.3(2Y4)
NetD50_2: D50.2(K) R82.2
NetD51_1: D51.1(A) U11.3(2Y4)
NetD51_2: D51.2(K) R83.2

### Notes on the sheet
- Mediciones:
  Tensión Vf LED rojo = 1.816V @ 1.2216mA.
  La intensidad del LED rojo 0603 con 1.2216mA
  es óptima, no molesta a la vista y se distingue
  muy bien.

### Library data of the parts
D20-D51 = LED2: Red LED 0603; Package: 0603 - 3.2X1.6X1.1; LCSC part: C2286
U8-U11 = SN74LVC244APWR: as U6 on sheet pc_data_bus_leds; Copyright: Copyright (C) 2026 Ultra Librarian. All rights reserved.; Manufacturer_Part_Number: SN74LVC244APWR; Datasheet: https://www.ti.com/lit/gpn/sn74lvc244a; RefDes: RefDes; Type: Type
R52-R83 = resistor: LCSC part: C22843; Package: 0603